# EasyEDA Pro project ProPrj_ROV_MINI_CTRL_2026-11-13.epro, schematic ROV_MINI_CTRL_V2.0.0

## Sheets
1 MCU: Assembly Variant: Basic; Board Name: Board2; Create Date: 2026-10-19; Page Name: MCU; Project Name: ROV_MINI_CTRL; Schematic Name: ROV_MINI_CTRL_V2.0.0; Update Date: 2026-10-19; Company: 嘉立创EDA; Page Size: A3; Version: V1.0
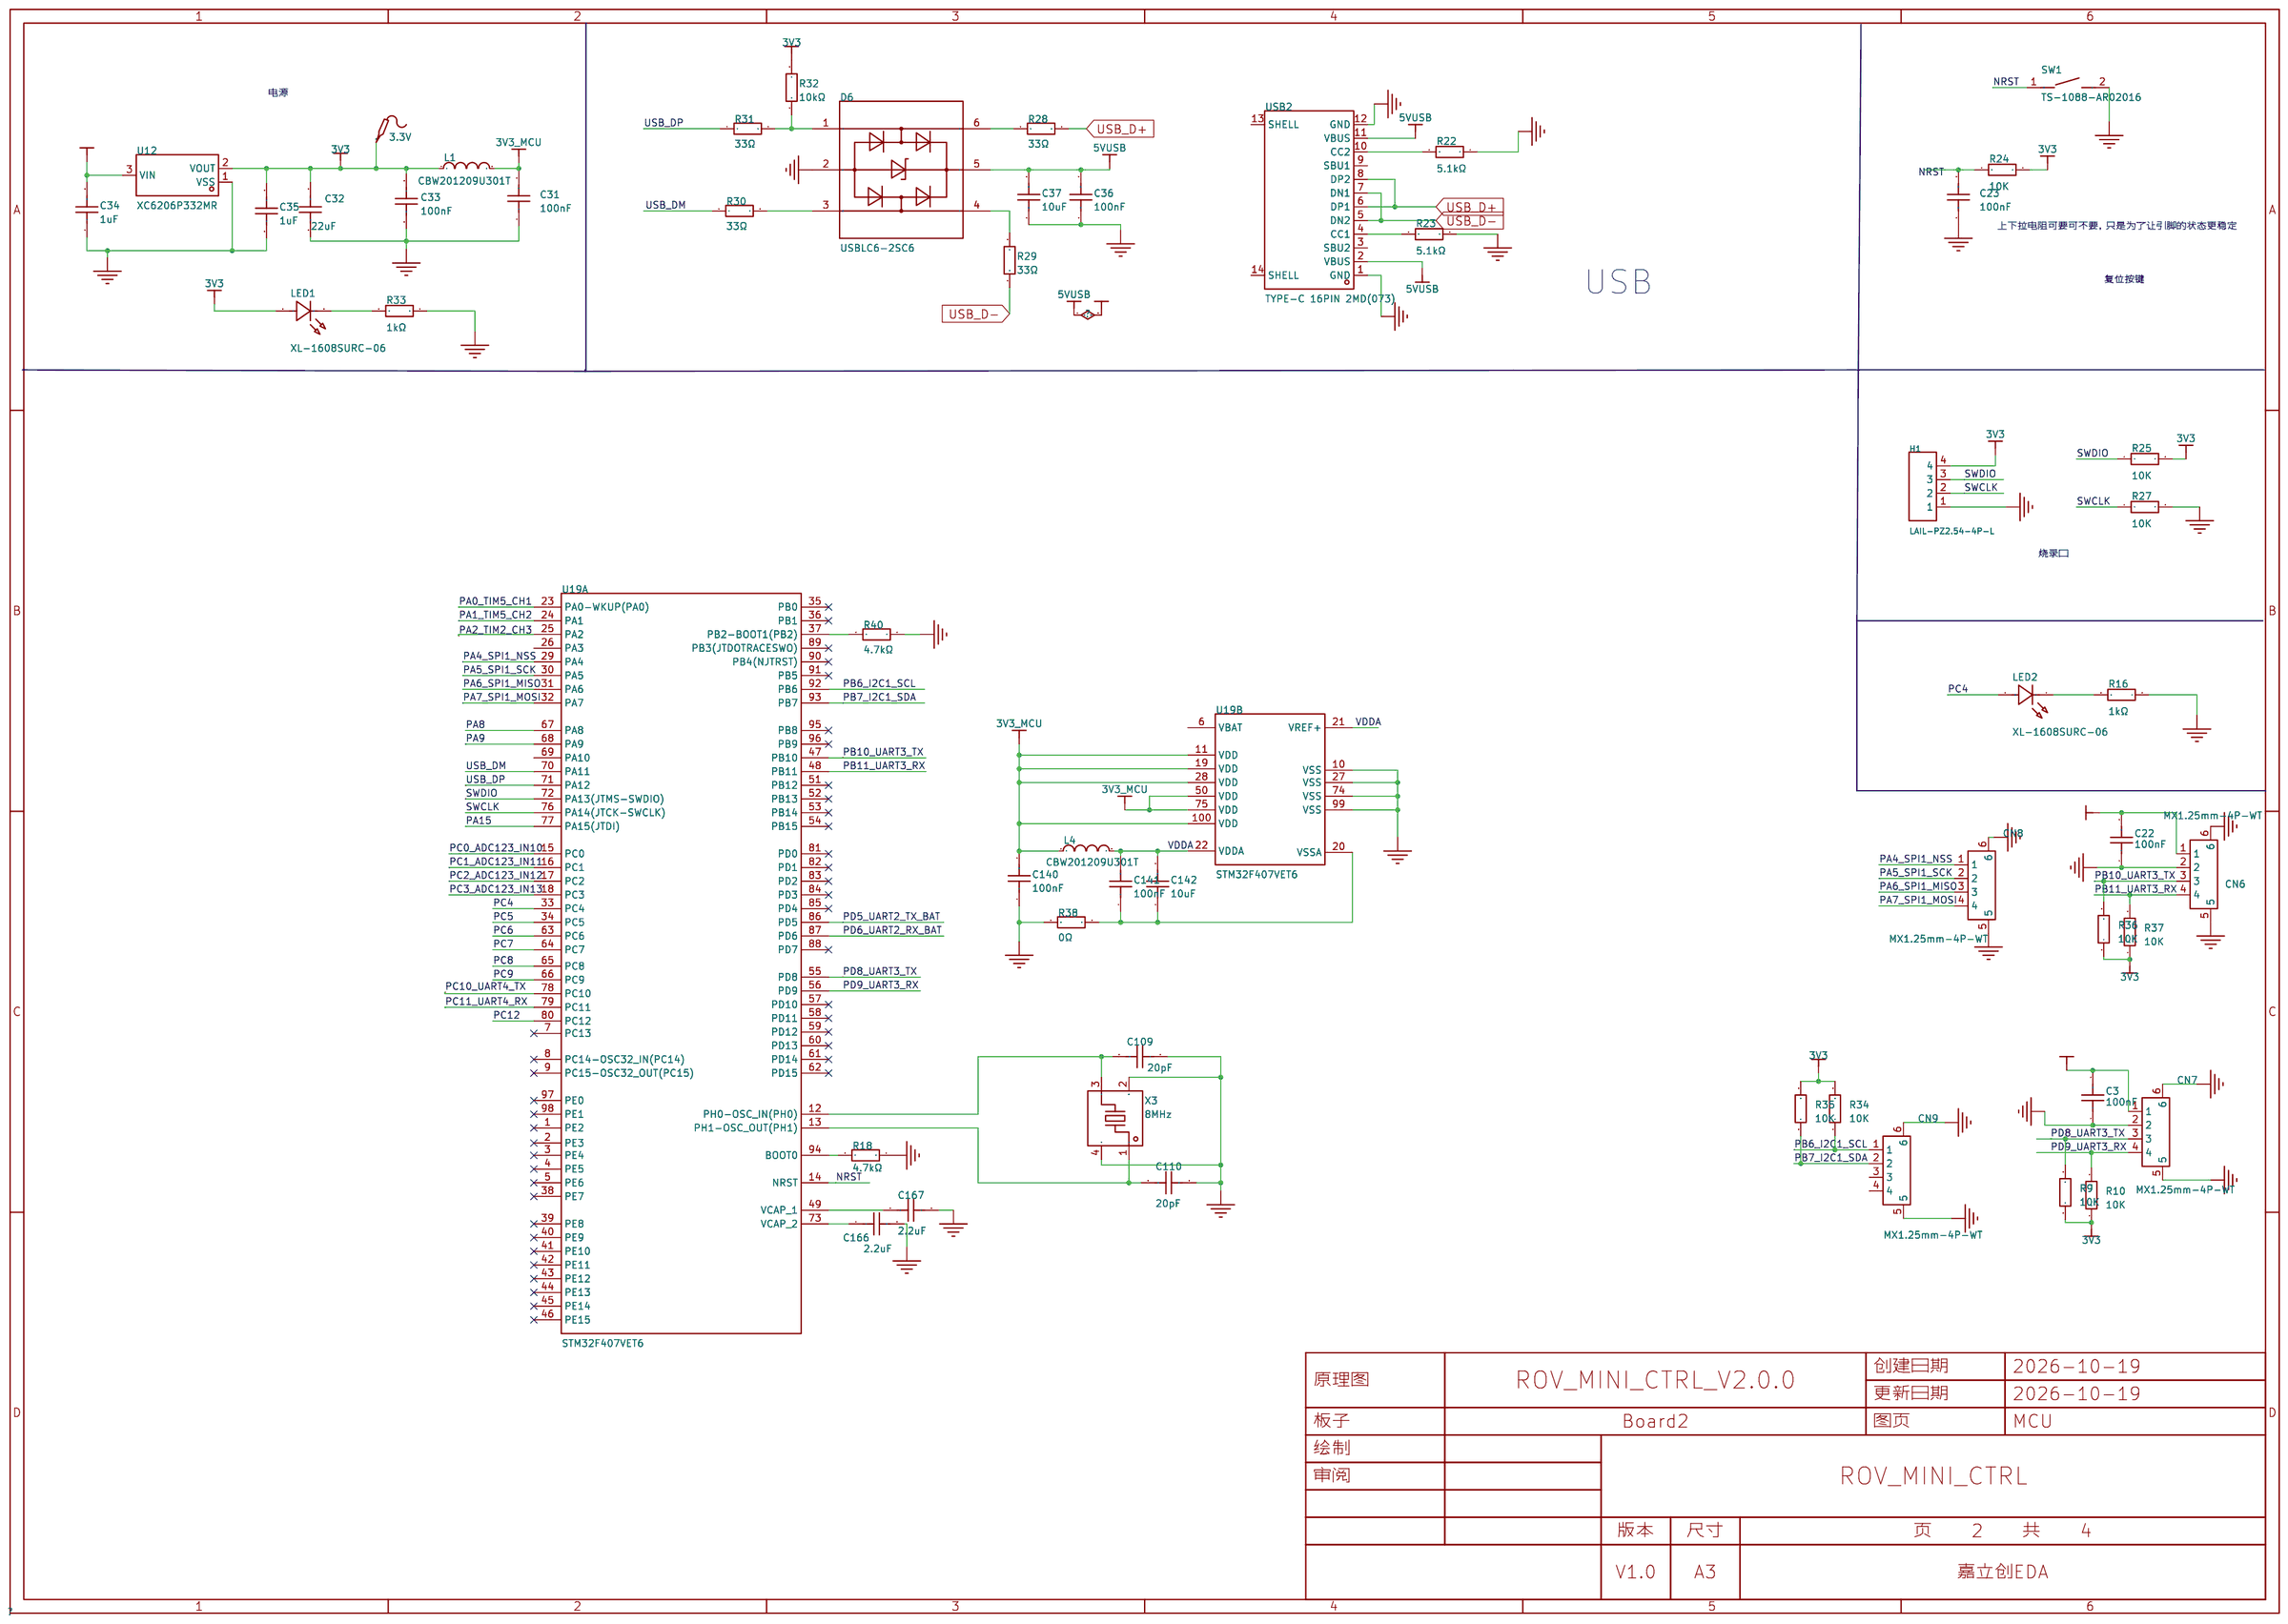
[diagram p3: MCU]
2 COM: Page Name: COM
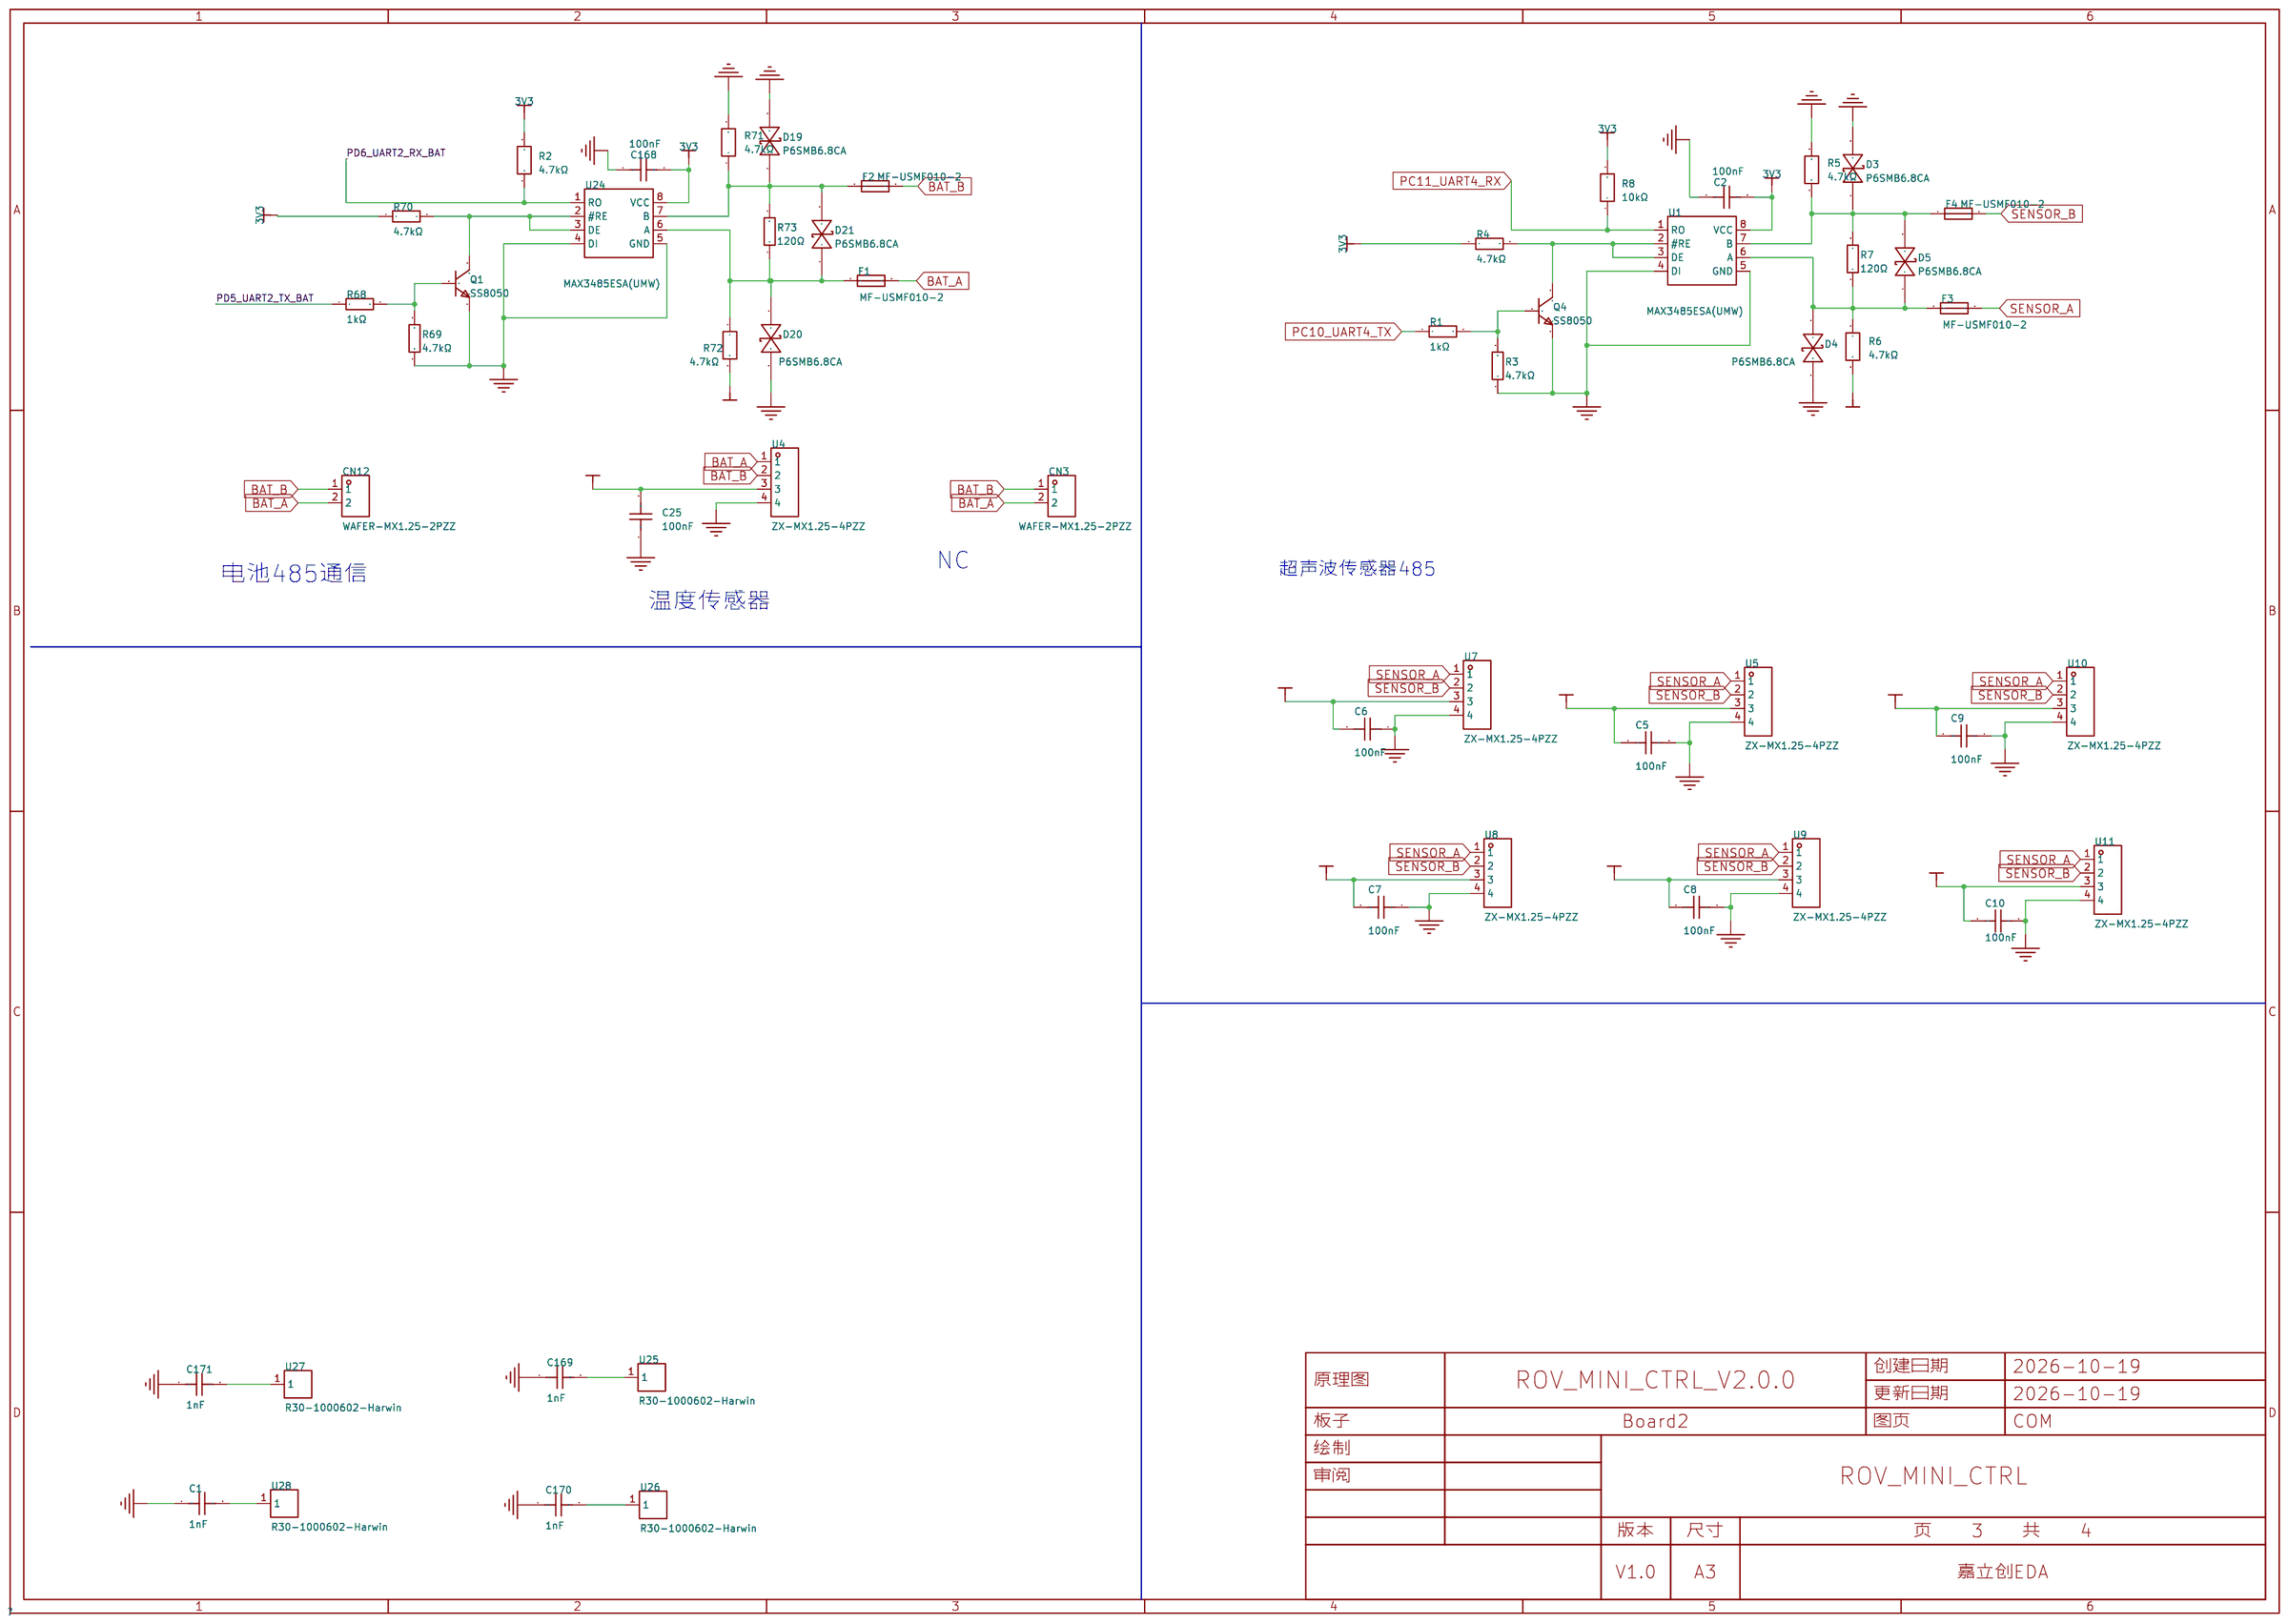
[diagram p4: COM]
3 POWER: Page Name: POWER
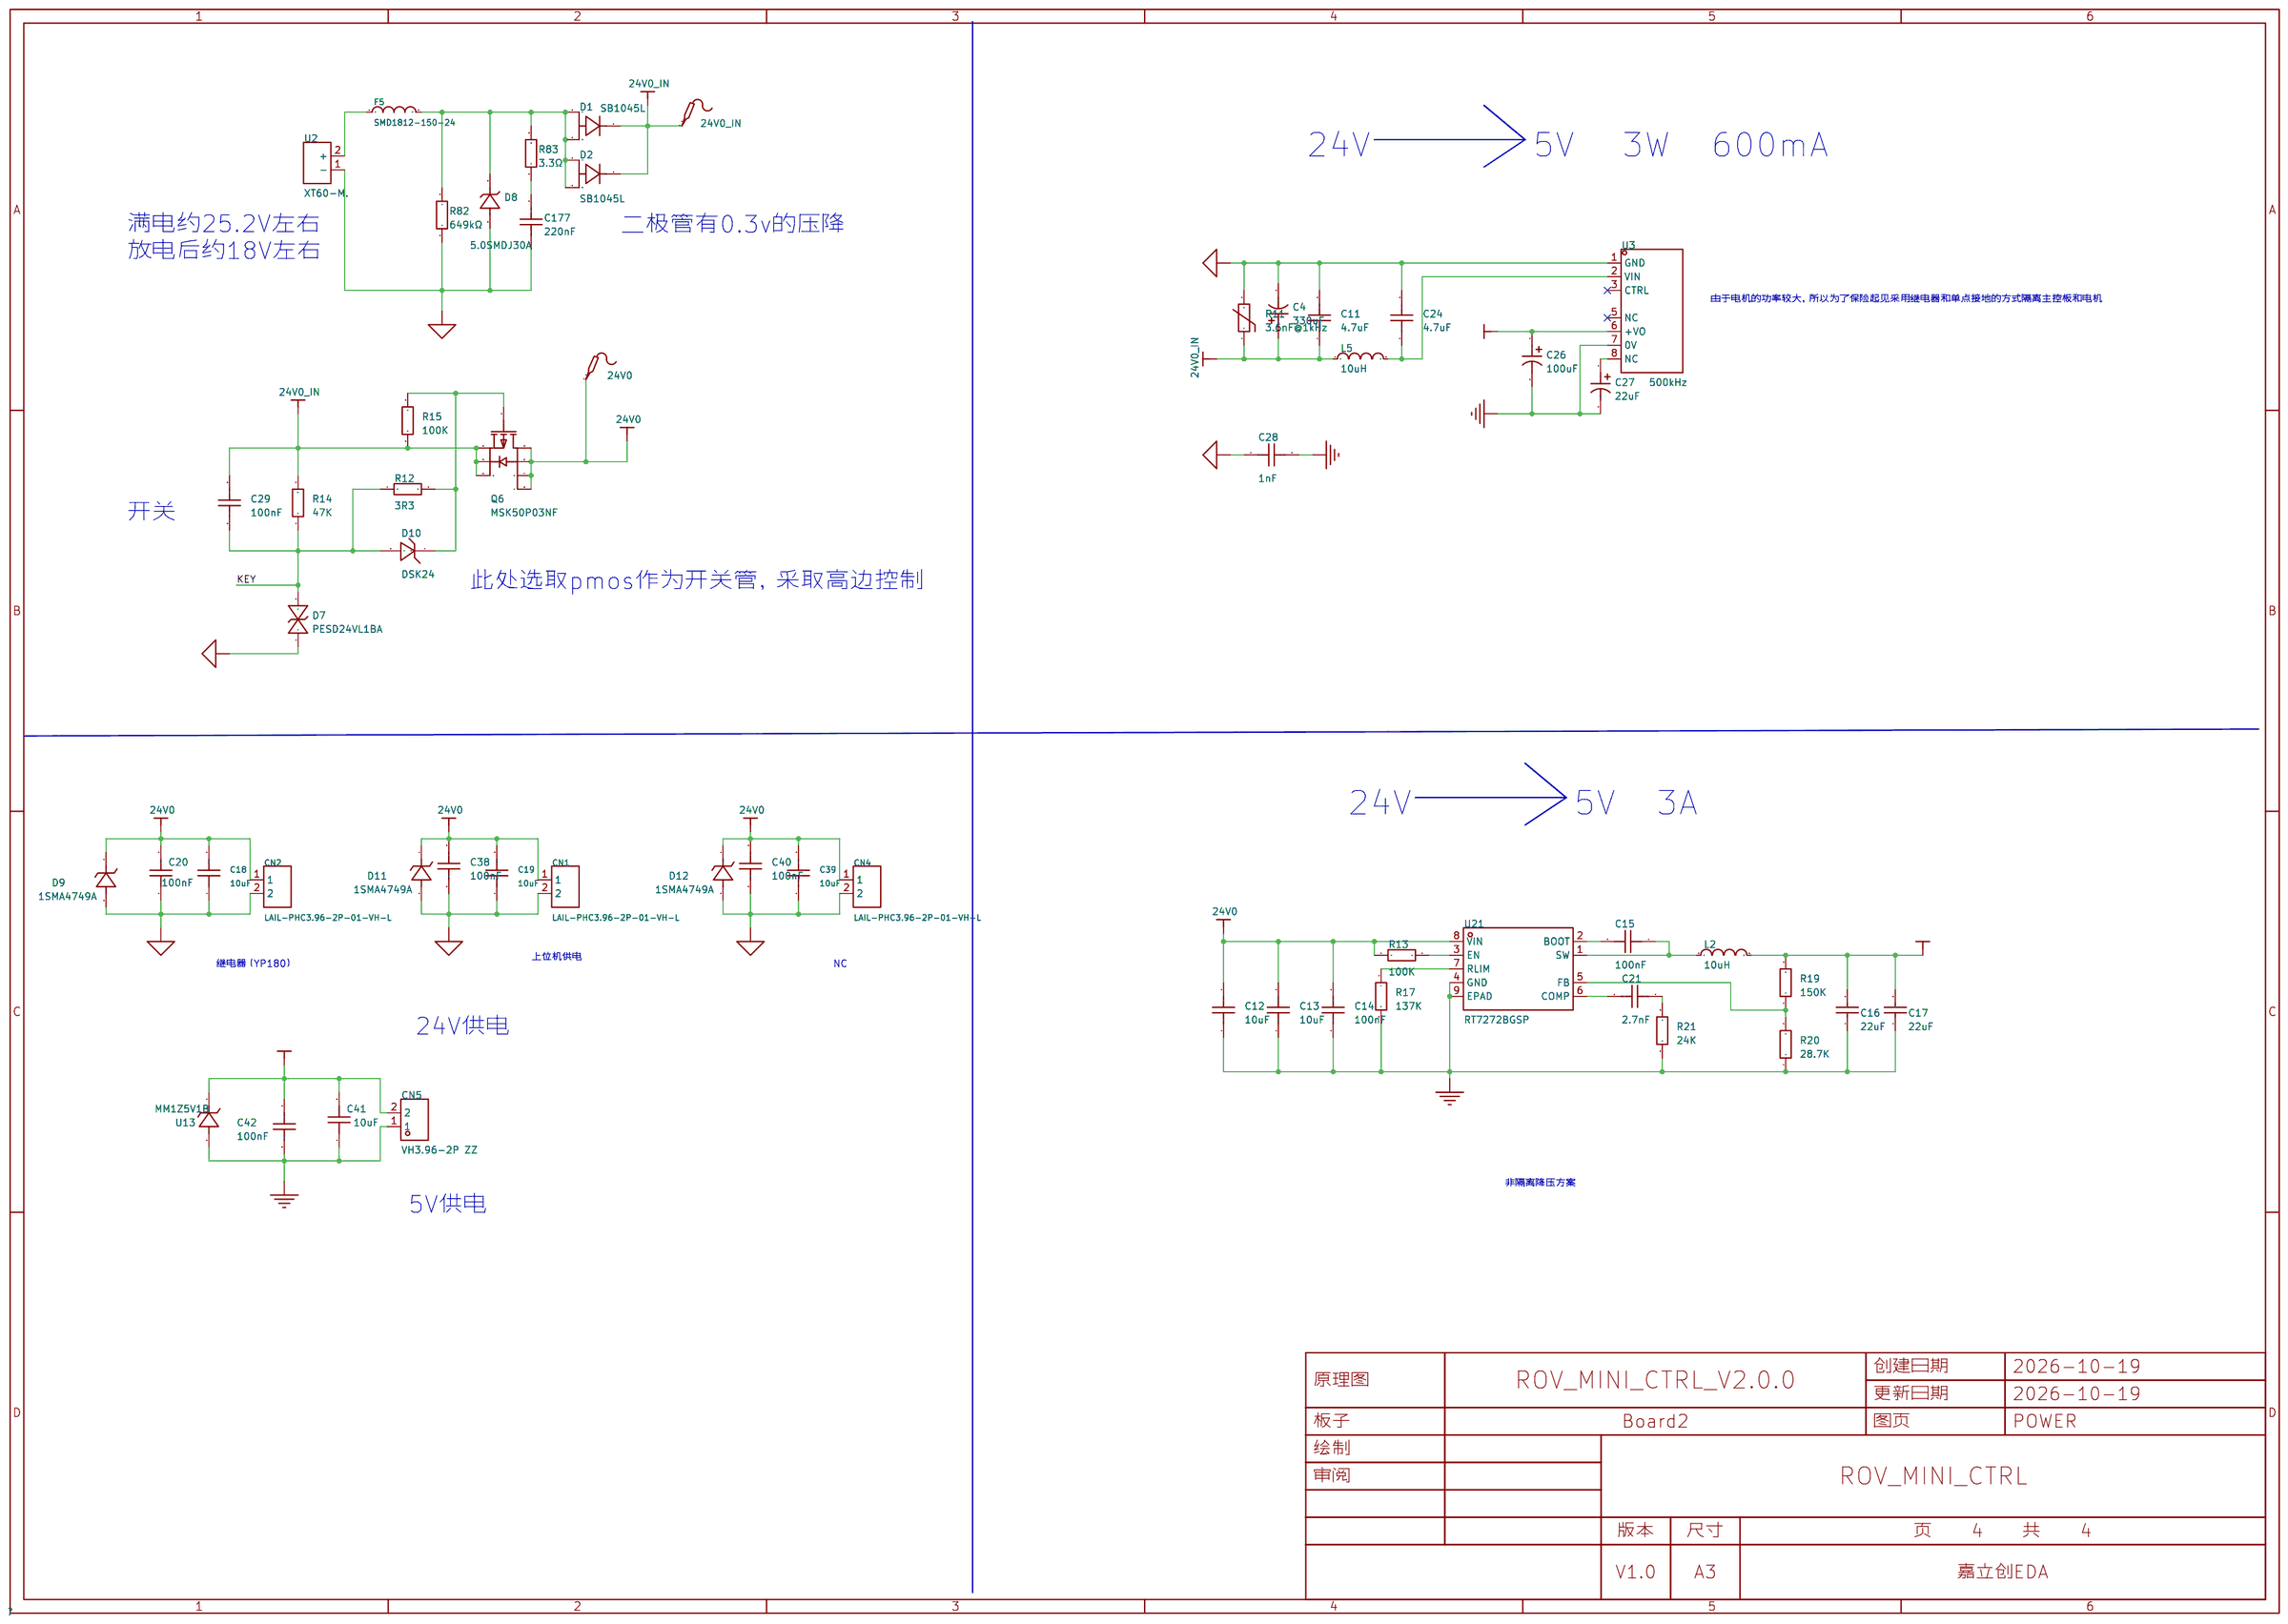
[diagram p5: POWER]
4 abstract: Create Date: 2026-10-16; Page Name: abstract; Update Date: 2026-10-16
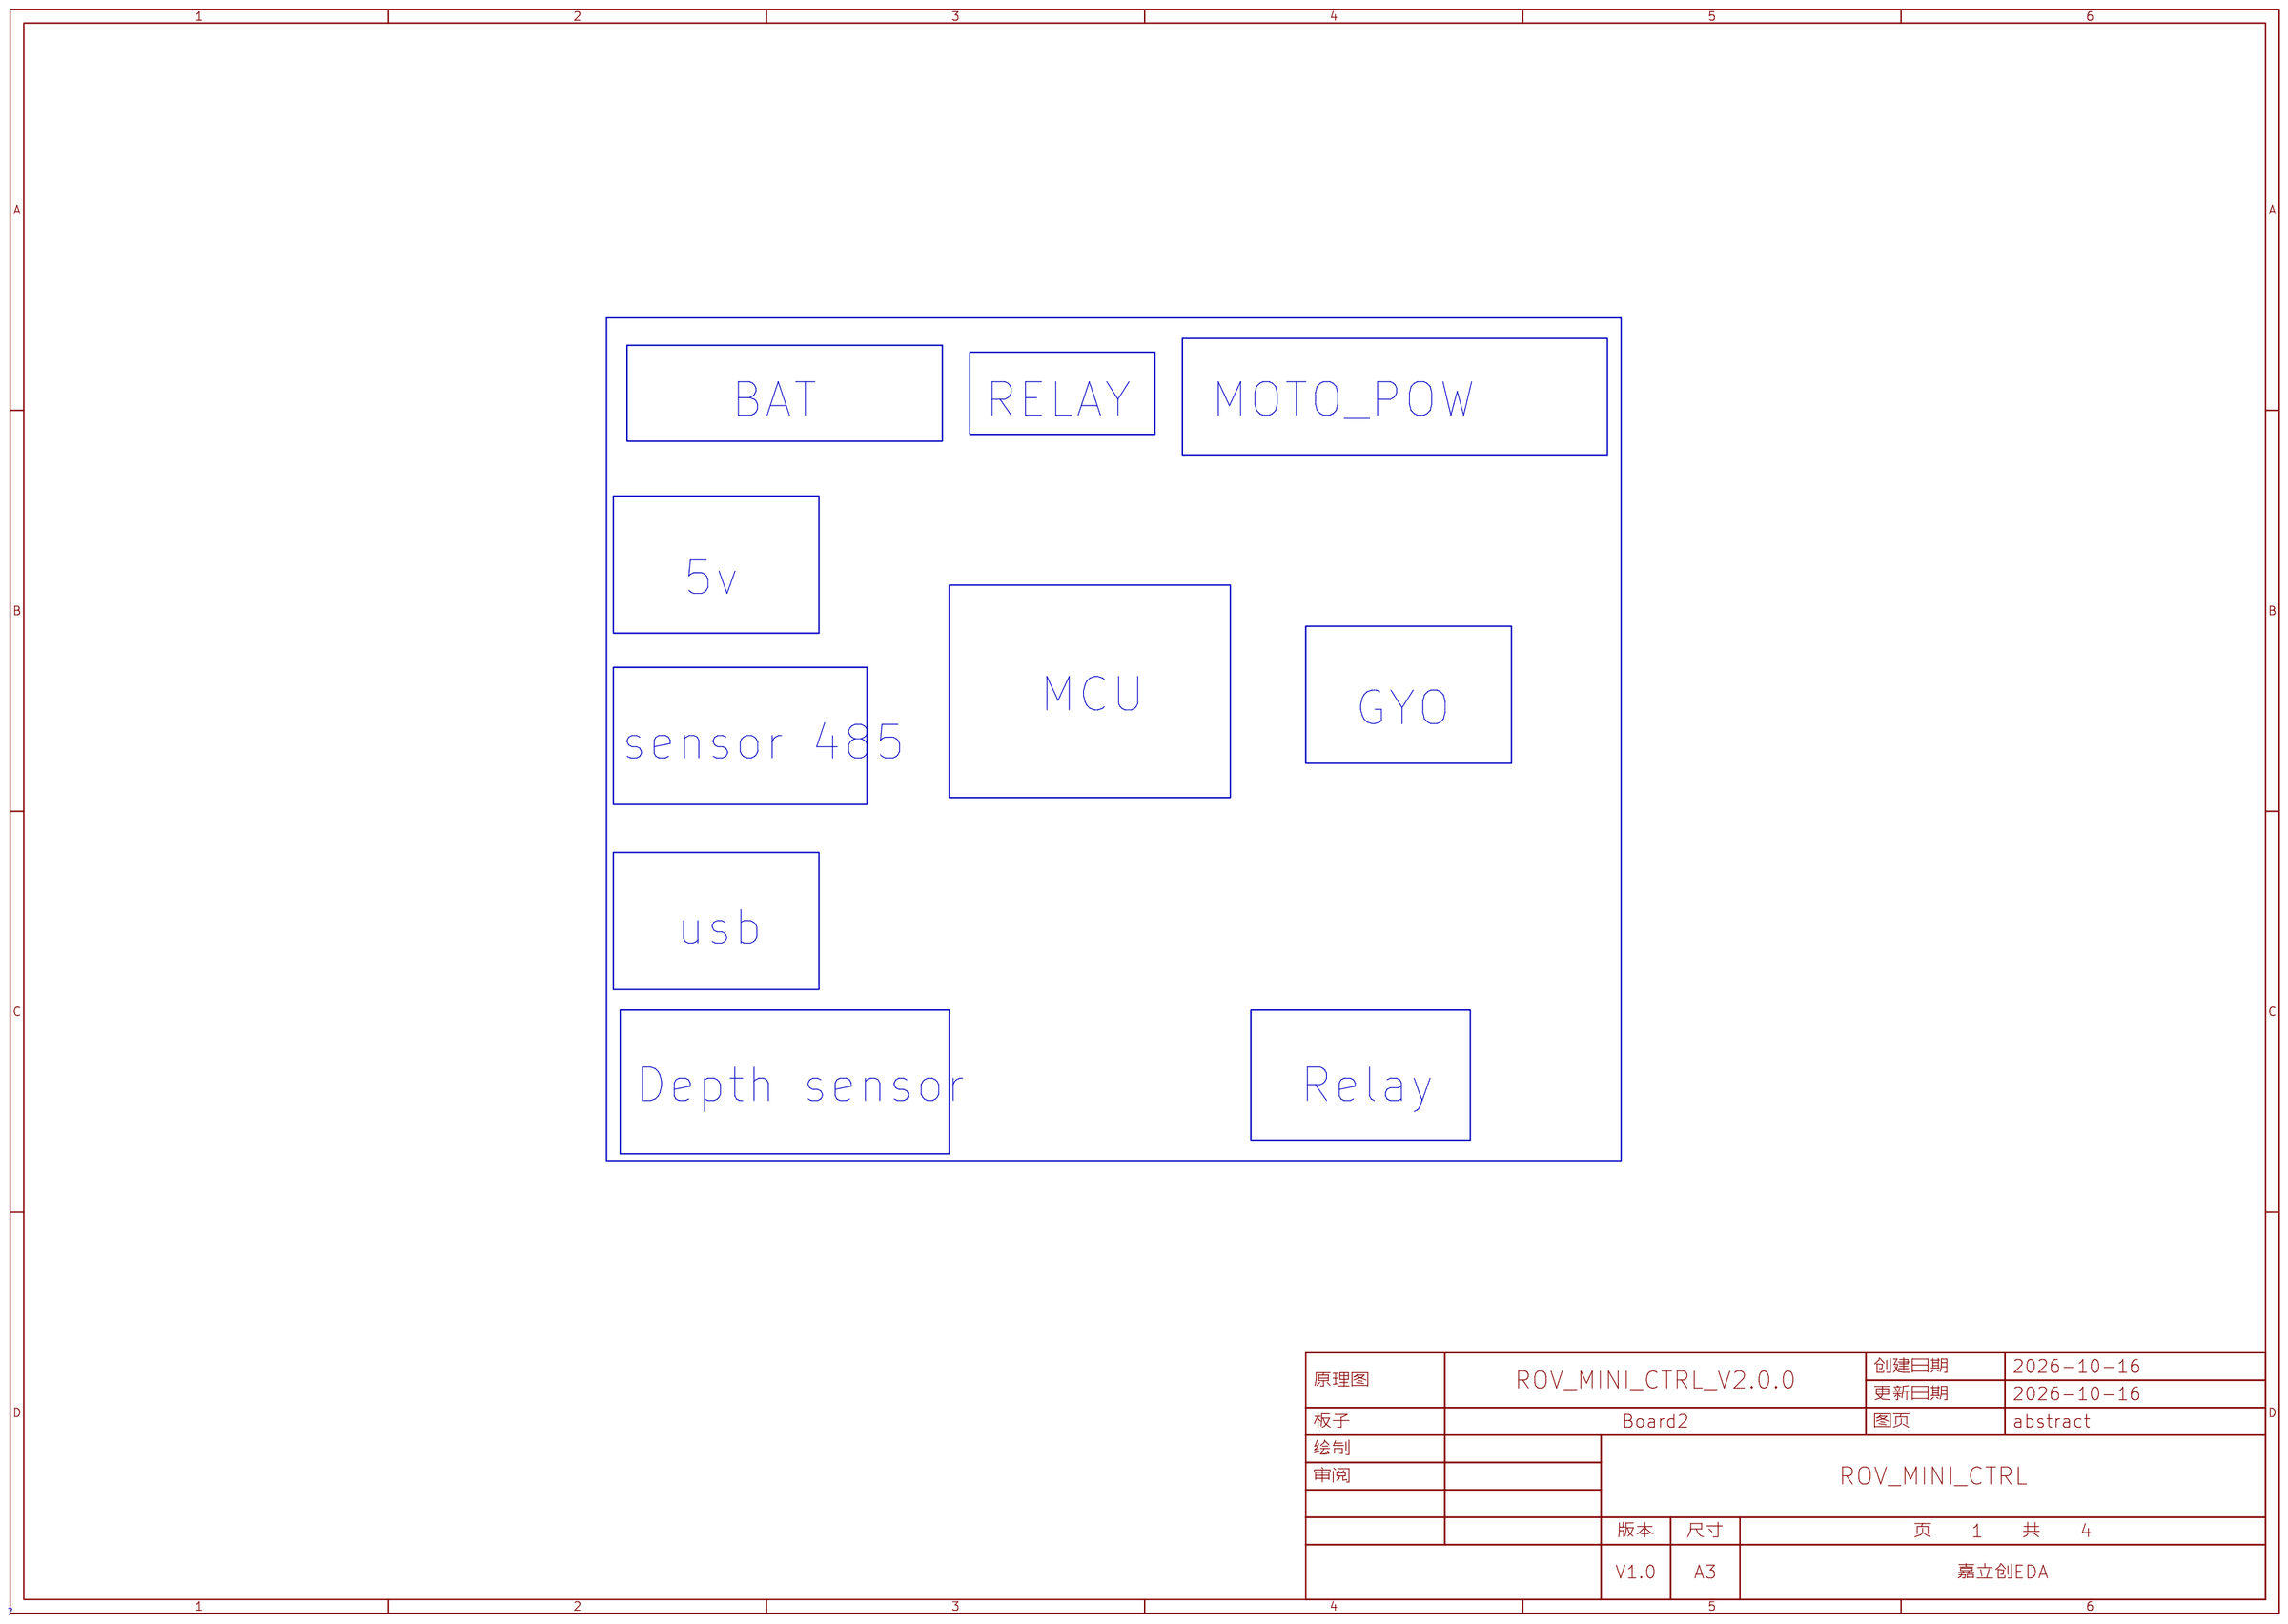
[diagram p6: abstract]

## Parts
sheet COM
C1  1nF  [C1206]
C2  100nF  [C0603]
C5  100nF  [C0603]
C6  100nF  [C0603]
C7  100nF  [C0603]
C8  100nF  [C0603]
C9  100nF  [C0603]
C10  100nF  [C0603]
C25  100nF  [C0603]
C168  100nF  [C0603]
C169  1nF  [C1206]
C170  1nF  [C1206]
C171  1nF  [C1206]
CN3  WAFER-MX1.25-2PZZ  [CONN-TH_2P-P1.25-V-M_721]
CN12  WAFER-MX1.25-2PZZ  [CONN-TH_2P-P1.25-V-M_721]
D3  P6SMB6.8CA  [SMB_L4.3-W3.6-LS5.4-BI]
D4  P6SMB6.8CA  [SMB_L4.3-W3.6-LS5.4-BI]
D5  P6SMB6.8CA  [SMB_L4.3-W3.6-LS5.4-BI]
D19  P6SMB6.8CA  [SMB_L4.3-W3.6-LS5.4-BI]
D20  P6SMB6.8CA  [SMB_L4.3-W3.6-LS5.4-BI]
D21  P6SMB6.8CA  [SMB_L4.3-W3.6-LS5.4-BI]
F1  MF-USMF010-2  [F1210]
F2  MF-USMF010-2  [F1210]
F3  MF-USMF010-2  [F1210]
F4  MF-USMF010-2  [F1210]
Q1  SS8050  [SOT-23_L2.9-W1.3-P1.90-LS2.4-BR]
Q4  SS8050  [SOT-23_L2.9-W1.3-P1.90-LS2.4-BR]
R1  1kΩ  [R0603]
R2  4.7kΩ  [R0603]
R3  4.7kΩ  [R0603]
R4  4.7kΩ  [R0603]
R5  4.7kΩ  [R0603]
R6  4.7kΩ  [R0603]
R7  120Ω  [R0603]
R8  10kΩ  [R0603]
R68  1kΩ  [R0603]
R69  4.7kΩ  [R0603]
R70  4.7kΩ  [R0603]
R71  4.7kΩ  [R0603]
R72  4.7kΩ  [R0603]
R73  120Ω  [R0603]
U1  MAX3485ESA(UMW)  [SOP-8_L5.0-W4.0-P1.27-LS6.0-BL]
U4  ZX-MX1.25-4PZZ  [CONN-TH_4P-P1.25_MEGASTAR_ZX-MX1.25-4PZZ]
U5  ZX-MX1.25-4PZZ  [CONN-TH_4P-P1.25_MEGASTAR_ZX-MX1.25-4PZZ]
U7  ZX-MX1.25-4PZZ  [CONN-TH_4P-P1.25_MEGASTAR_ZX-MX1.25-4PZZ]
U8  ZX-MX1.25-4PZZ  [CONN-TH_4P-P1.25_MEGASTAR_ZX-MX1.25-4PZZ]
U9  ZX-MX1.25-4PZZ  [CONN-TH_4P-P1.25_MEGASTAR_ZX-MX1.25-4PZZ]
U10  ZX-MX1.25-4PZZ  [CONN-TH_4P-P1.25_MEGASTAR_ZX-MX1.25-4PZZ]
U11  ZX-MX1.25-4PZZ  [CONN-TH_4P-P1.25_MEGASTAR_ZX-MX1.25-4PZZ]
U24  MAX3485ESA(UMW)  [SOP-8_L5.0-W4.0-P1.27-LS6.0-BL]
U25  R30-1000602-Harwin  [SMD_BD5.0-D3.0]
U26  R30-1000602-Harwin  [SMD_BD5.0-D3.0]
U27  R30-1000602-Harwin  [SMD_BD5.0-D3.0]
U28  R30-1000602-Harwin  [SMD_BD5.0-D3.0]
sheet MCU
3.3V  -  [Test-Point-0.5mm]
C3  100nF  [C0603]
C22  100nF  [C0603]
C23  100nF  [C0603]
C31  100nF  [C0603]
C32  22uF  [C0603]
C33  100nF  [C0603]
C34  1uF  [C0603]
C35  1uF  [C0603]
C36  100nF  [C0603]
C37  10uF  [C0603]
C109  20pF  [C0603]
C110  20pF  [C0603]
C140  100nF  [C0603]
C141  100nF  [C0603]
C142  10uF  [C0603]
C166  2.2uF  [C0603]
C167  2.2uF  [C0603]
CN6  MX1.25mm-4P-WT  [CONN-SMD_MX1.25MM-4P-WT]
CN7  MX1.25mm-4P-WT  [CONN-SMD_MX1.25MM-4P-WT]
CN8  MX1.25mm-4P-WT  [CONN-SMD_MX1.25MM-4P-WT]
CN9  MX1.25mm-4P-WT  [CONN-SMD_MX1.25MM-4P-WT]
D6  USBLC6-2SC6  [SOT-23-6_L2.9-W1.6-P0.95-LS2.8-BL]
H1  LAIL-PZ2.54-4P-L  [CONN-TH_LAIL-PZ2.54-4P-L]
L1  CBW201209U301T  [L0805]
L4  CBW201209U301T  [L0805]
LED1  XL-1608SURC-06  [LED0603-RD_RED]
LED2  XL-1608SURC-06  [LED0603-RD_RED]
R9  10K  [R0603]
R10  10K  [R0603]
R16  1kΩ  [R0603]
R18  4.7kΩ  [R0603]
R22  5.1kΩ  [R0603]
R23  5.1kΩ  [R0603]
R24  10K  [R0603]
R25  10K  [R0603]
R27  10K  [R0603]
R28  33Ω  [R0603]
R29  33Ω  [R0603]
R30  33Ω  [R0603]
R31  33Ω  [R0603]
R32  10kΩ  [R0603]
R33  1kΩ  [R0603]
R34  10K  [R0603]
R35  10K  [R0603]
R36  10K  [R0603]
R37  10K  [R0603]
R38  0Ω  [R0603]
R40  4.7kΩ  [R0603]
SW1  TS-1088-AR02016  [SW-SMD_L3.9-W3.0-P4.45]
U12  XC6206P332MR  [SOT-23-3_L3.0-W1.7-P0.95-LS2.9-BR]
U19  STM32F407VET6  [LQFP-100_L14.0-W14.0-P0.50-LS16.0-BL]  (sections 1,2)
USB2  TYPE-C 16PIN 2MD(073)  [USB-C-SMD_TYPE-C-6PIN-2MD-073]
X3  8MHz  [CRYSTAL-SMD_4P-L3.2-W2.5-BL]
sheet POWER
24V0  -  [Test-Point-0.5mm]
24V0_IN  -  [Test-Point-0.5mm]
C4  330uF  [CAP-SMD_BD10.0-L10.3-W10.3-FD-LS11.0]
C11  4.7uF  [C0805]
C12  10uF  [C0603]
C13  10uF  [C0603]
C14  100nF  [C0603]
C15  100nF  [C0603]
C16  22uF  [C1206]
C17  22uF  [C1206]
C18  10uF  [C1206]
C19  10uF  [C1206]
C20  100nF  [C0603]
C21  2.7nF  [C0603]
C24  4.7uF  [C0805]
C26  100uF  [CAP-SMD_BD6.3-L6.6-W6.6-LS7.3-FD-H7.7]
C27  22uF  [CAP-SMD_BD6.3-L6.6-W6.6-LS7.2-FD_3]
C28  1nF  [CAP-TH_L7.5-W4.5-P10.00-D0.6]
C29  100nF  [C0603]
C38  100nF  [C0603]
C39  10uF  [C1206]
C40  100nF  [C0603]
C41  10uF  [C0603]
C42  100nF  [C0603]
C177  220nF  [C0603]
CN1  LAIL-PHC3.96-2P-01-VH-L  [CONN-TH_2P-P3.96_YTC-A3961-2A]
CN2  LAIL-PHC3.96-2P-01-VH-L  [CONN-TH_2P-P3.96_YTC-A3961-2A]
CN4  LAIL-PHC3.96-2P-01-VH-L  [CONN-TH_2P-P3.96_YTC-A3961-2A]
CN5  VH3.96-2P ZZ  [CONN-TH_2P-P3.96_C9900035759]
D1  SB1045L  [TO-277_3P-L5.4-W4.0-LS6.5-TR]
D2  SB1045L  [TO-277_3P-L5.4-W4.0-LS6.5-TR]
D7  PESD24VL1BA  [SOD-323_L1.7-W1.3-LS2.5-BI-1]
D8  5.0SMDJ30A  [SMC_L6.9-W5.9-LS7.9-RD]
D9  1SMA4749A  [SMA_L4.3-W2.6-LS5.0-RD]
D10  DSK24  [SOD-123FL_L2.7-W1.8-LS3.8-RD]
D11  1SMA4749A  [SMA_L4.3-W2.6-LS5.0-RD]
D12  1SMA4749A  [SMA_L4.3-W2.6-LS5.0-RD]
F5  SMD1812-150-24  [F1812]
L2  10uH  [IND-SMD_L7.1-W6.6]
L5  10uH  [IND-TH_L16.0-W8.5-P5.00-D0.7]
Q6  MSK50P03NF  [DFN-8_L6.0-W5.0-P1.27-LS6.2-BL]
R11  3.6nF@1kHz  [RES-TH_L16.0-W4.5-P7.50-D0.8]
R12  3R3  [R0603]
R13  100K  [R0603]
R14  47K  [R0603]
R15  100K  [R0603]
R17  137K  [R0603]
R19  150K  [R0603]
R20  28.7K  [R0603]
R21  24K  [R0603]
R82  649kΩ  [R0603]
R83  3.3Ω  [R0603]
U2  XT60-M.  [CONN-TH_XT60]
U3  500kHz  [PWRM-TH_URBXXXXS-6WR3]
U13  MM1Z5V1B  [SOD-123_L2.7-W1.6-LS3.7-RD]
U21  RT7272BGSP  [SOIC-8_L5.0-W4.0-P1.27-LS6.0-BL-EP2.0]

## Library data of the parts
C1 C169-C171 = 1206B102K202NT: 容值:1nF;精度:±10%;额定电压:2kV;温度系数:X7R;; LCSC Part Name: 1nF ±10% 2kV; Supplier Part: C9196; Manufacturer: FH(风华); Supplier Footprint: 1206; JLCPCB Part Class: Basic Part; Datasheet: https://atta.szlcsc.com/upload/public/pdf/source/20200305/C486355_26A10D38EF8C2A5C37091D0039909270.pdf; Supplier: LCSC; Tolerance: ±10%; Voltage Rating: 2kV; Temperature Coefficient: X7R
C2 C31 C33 C36 C140 C141 C168 = CGA0603X7R104K500JT: 容值:100nF;精度:±10%;额定电压:50V;温度系数:X7R;; LCSC Part Name: 100nF ±10% 50V; Supplier Part: C6119867; Manufacturer: HRE(芯声); Supplier Footprint: 0603; JLCPCB Part Class: Extended Part; Datasheet: https://atta.szlcsc.com/upload/public/pdf/source/20250103/C44077DA9E7B3EFAE02F22B6D3D1CBC9.pdf; Supplier: LCSC; Tolerance: ±10%; Voltage Rating: 50V; Temperature Coefficient: X7R
C3 C5-C10 C12-C15 C20-C23 C25 C29 C38 C40 = CAP_0603: Supplier Footprint: 0603
CN3 CN12 = WAFER-MX1.25-2PZZ: 插针结构:1x2P;间距:1.25mm;安装方式:直插;参考系列:PicoBlade(MX 1.25);总PIN数:2P;排数:1;每排PIN数:2;行距:-;额定电流:1A;触头材质:黄铜;触头镀层:锡;工作温度:-25℃~+85℃;; LCSC Part Name: 1x2P 间距:1.25mm 直插 系列:PicoBlade(MX 1.25); Supplier Part: C3029395; Manufacturer: XUNPU(讯普); Supplier Footprint: 插件,P=1.25mm; JLCPCB Part Class: 扩展库; Datasheet: https://item.szlcsc.com/datasheet/WAFER-MX1.25-2PZZ/3561407.html; Supplier: LCSC; Pins Structure: 1x2P; Pitch: 1.25mm; Mounting Type: 直插; Reference Series: PicoBlade(MX 1.25); Number of Pins: 2P; Number of Rows: 1; Number of PINs Per Row: 2; Current Rating: 1A; Contact Material: 黄铜; Contact Plating: 锡; Operating Temperature: -25℃~+85℃; Voltage Rating: 125V; Plastic Material: LCP; Flame Retardant Rating: UL94V-0; Color: 米色; Z-Height of the Board: 4.6mm; X-Length of Bottom Edge on Board (Spacing Line): 4.4mm; Y-Width of Bottom Edge on Board: 3.3mm
D3-D5 D19-D21 = P6SMB6.8CA_C2758563: 反向截止电压(Vrwm):5.8V;钳位电压:10.5V;峰值脉冲电流(Ipp):57.1A;击穿电压:6.45V;; Supplier Part: C2758563; Manufacturer: UMW(友台半导体); Supplier Footprint: SMB; JLCPCB Part Class: 扩展库; Datasheet: https://atta.szlcsc.com/upload/public/pdf/source/20220418/9BDF7C7F05B151FF0DC9933F98EB12D8.pdf; Supplier: LCSC; Reverse Stand-Off Voltage (Vrwm): 5.8V; Clamping Voltage: 10.5V; Peak Pulse Current (Ipp): 57.1A; Voltage - Breakdown: 6.45V; Reverse Leakage Current (Ir): 1mA; Type: TVS
F1-F4 = MF-USMF010-2: 耐压(Vmax):30V;最大电流(Imax):-;保持电流(Ihold):-;跳闸电流(Itrip):-;; LCSC Part Name: 30V 100mA 1210自恢复; Supplier Part: C210359; Manufacturer: BOURNS; Supplier Footprint: 1210; JLCPCB Part Class: 扩展库; Datasheet: https://item.szlcsc.com/datasheet/MF-USMF010-2/211706.html; Supplier: LCSC; Voltage - Max: 30V; Resistance - Initial (Ri) (Min): 800mΩ; Resistance - Post Trip (R1) (Max): 15Ω; Operating Temperature: -40℃~+85℃; Length: 3.2mm; Width: 2.5mm
Q1 Q4 = SS8050_C431710: 晶体管类型:NPN;集电极电流(Ic):1.5A;集射极击穿电压(Vceo):25V;功率(Pd):300mW;直流电流增益(hFE@Ic,Vce):120@100mA,1V;; LCSC Part Name: NPN 电流:1.5A 耐压:25V (200-350); Supplier Part: C431710; Manufacturer: MDD(辰达半导体); Supplier Footprint: SOT-23; JLCPCB Part Class: 扩展库; Datasheet: https://atta.szlcsc.com/upload/public/pdf/source/20240710/2275D45831FEB988B7478BE0F5F4041C.pdf; Supplier: LCSC; Transistor Type: NPN; Collector Current (Ic): 1.5A; Collector-Emitter Breakdown Voltage (Vceo): 25V; Power Dissipation (Pd): 300mW; DC Current Gain (hFE@Ic,Vce): 120@100mA,1V; Transition Frequency (fT): 100MHz; Collector Cut-Off Current (Icbo): 100nA; Collector-Emitter Saturation Voltage (VCE(sat)@Ic,Ib): 500mV@800mA,80mA; Operating Temperature: -55℃~+150℃
R1 R16 R33 R68 = 0603WAF1001T5E: 电阻类型:厚膜电阻;阻值:1kΩ;精度:±1%;功率:100mW;工作电压:75V;温度系数:±100ppm/℃;; LCSC Part Name: 1kΩ ±1% 100mW 厚膜电阻; Supplier Part: C21190; Manufacturer: UNI-ROYAL(厚声); Supplier Footprint: 0603; JLCPCB Part Class: Basic Part; Datasheet: https://item.szlcsc.com/datasheet/0603WAF1001T5E/21904.html; Supplier: LCSC; Type: 厚膜电阻; Tolerance: ±1%; Power(Watts): 100mW; Overload Voltage (Max): 75V; Temperature Coefficient: ±100ppm/℃; Operating Temperature Range: -55℃~+155℃; Voltage-Supply(Max): 75V; Operating Temperature: -55℃~+155℃
R2 R5 R6 R18 R40 R71 R72 = FRC0603J472 TS: 电阻类型:厚膜电阻;阻值:4.7kΩ;精度:±5%;功率:100mW;工作电压:75V;温度系数:±100ppm/℃;; LCSC Part Name: 4.7kΩ ±5% 100mW 厚膜电阻; Supplier Part: C2907166; Manufacturer: FOJAN(富捷); Supplier Footprint: 0603; JLCPCB Part Class: Extended Part; Supplier: LCSC; Type: 厚膜电阻; Tolerance: ±5%; Power(Watts): 100mW; Voltage-Supply(Max): 75V; Temperature Coefficient: ±100ppm/℃; Operating Temperature: -55℃~+155℃
R3 R4 R69 R70 = 0603WAF4701T5E: 电阻类型:厚膜电阻;阻值:4.7kΩ;精度:±1%;功率:100mW;工作电压:75V;温度系数:±100ppm/℃;; LCSC Part Name: 4.7kΩ ±1% 100mW 厚膜电阻; Supplier Part: C23162; Manufacturer: UNI-ROYAL(厚声); Supplier Footprint: 0603; JLCPCB Part Class: Basic Part; Datasheet: https://item.szlcsc.com/datasheet/0603WAF4701T5E/23889.html; Supplier: LCSC; Type: 厚膜电阻; Tolerance: ±1%; Power(Watts): 100mW; Voltage-Supply(Max): 75V; Temperature Coefficient: ±100ppm/℃; Operating Temperature: -55℃~+155℃
R7 R73 = 0603WAF1200T5E: 电阻类型:厚膜电阻;阻值:120Ω;精度:±1%;功率:100mW;工作电压:75V;温度系数:±100ppm/℃;; LCSC Part Name: 120Ω ±1% 100mW 厚膜电阻; Supplier Part: C22787; Manufacturer: UNI-ROYAL(厚声); Supplier Footprint: 0603; JLCPCB Part Class: Basic Part; Datasheet: https://item.szlcsc.com/datasheet/0603WAF1200T5E/23514.html; Supplier: LCSC; Type: 厚膜电阻; Tolerance: ±1%; Power(Watts): 100mW; Voltage-Supply(Max): 75V; Temperature Coefficient: ±100ppm/℃; Operating Temperature: -55℃~+155℃
R8 = FRC0603J103 TS: 电阻类型:厚膜电阻;阻值:10kΩ;精度:±5%;功率:100mW;工作电压:75V;温度系数:±100ppm/℃;; LCSC Part Name: 10kΩ ±5% 100mW 厚膜电阻; Supplier Part: C2930027; Manufacturer: FOJAN(富捷); Supplier Footprint: 0603; JLCPCB Part Class: Extended Part; Datasheet: https://item.szlcsc.com/datasheet/FRC0603J103%2520TS/3266960.html; Supplier: LCSC; Type: 厚膜电阻; Tolerance: ±5%; Power(Watts): 100mW; Voltage-Supply(Max): 75V; Temperature Coefficient: ±100ppm/℃; Operating Temperature: -55℃~+155℃
U1 U24 = MAX3485ESA(UMW): 类型:收发器;数据速率:12Mbps;; LCSC Part Name: MAX3485E 3.3V供电，半双工，12Mbps速率，RS485/RS422收发器; Supplier Part: C668204; Manufacturer: UMW(友台半导体); Supplier Footprint: SOP-8; JLCPCB Part Class: 扩展库; Datasheet: https://item.szlcsc.com/datasheet/MAX3485ESA(UMW)/698052.html; Supplier: LCSC; Type: 收发器; Number of Drivers: 1; Number of Receivers: 1; Voltage - Supply: 2.97V~3.63V; Data Rate: 12Mbps; Number of Nodes: 256; Operating Temperature: -40℃~+85℃; Communication Mode: 半双工
U4 U5 U7-U11 = ZX-MX1.25-4PZZ: 插针结构:1x4P;间距:1.25mm;安装方式:直插;参考系列:PicoBlade(MX 1.25);总PIN数:4P;排数:1;每排PIN数:4;行距:-;额定电流:1A;触头材质:黄铜;触头镀层:锡;工作温度:-25℃~+85℃;; LCSC Part Name: 1x4P 间距:1.25mm 直插 系列:PicoBlade(MX 1.25); Supplier Part: C7430460; Manufacturer: Megastar(兆星); Supplier Footprint: 插件,P=1.25mm; JLCPCB Part Class: Extended Part; Datasheet: https://item.szlcsc.com/datasheet/ZX-MX1.25-4PZZ/8430329.html; Supplier: LCSC; Pins Structure: 1x4P; Pitch: 1.25mm; Mounting Type: 直插; Reference Series: PicoBlade(MX 1.25); Number of Pins: 4P; Number of Rows: 1; Number of PINs Per Row: 4; Current Rating: 1A; Contact Material: 黄铜; Contact Plating: 锡; Operating Temperature: -25℃~+85℃; Voltage Rating: 125V; Plastic Material: LCP; Flame Retardant Rating: UL94V-0; Color: 米色; Z-Height of the Board: 4.6mm; X-Length of Bottom Edge on Board (Spacing Line): 6.9mm; Y-Width of Bottom Edge on Board: 3.3mm
U25-U28 = R30-1000602-Harwin: LCSC Part Name: HARWIN M3 x 0.5六角黄铜螺母柱,6mm总长,5mm六角对边, R30-1000602 rs1613559; Supplier Part: C47018769; Manufacturer: Harwin; Datasheet: https://item.szlcsc.com/datasheet/R30-1000602-Harwin/49200836.html; Supplier: LCSC
3.3V 24V0 = Test-Point: Test Point 测试点
C32 = CL10A226MQ8NRNC: 容值:22uF;精度:±20%;额定电压:6.3V;温度系数:X5R;; LCSC Part Name: 22uF ±20% 6.3V; Supplier Part: C59461; Manufacturer: SAMSUNG(三星); Supplier Footprint: 0603; JLCPCB Part Class: Basic Part; Datasheet: https://item.szlcsc.com/datasheet/CL10A226MQ8NRNC/60514.html; Supplier: LCSC; Tolerance: ±20%; Voltage Rating: 6.3V; Temperature Coefficient: X5R
C34 C35 = CGA0603X5R105K500JT: 容值:1uF;精度:±10%;额定电压:50V;温度系数:X5R;; LCSC Part Name: 1uF ±10% 50V; Supplier Part: C6119852; Manufacturer: HRE(芯声); Supplier Footprint: 0603; JLCPCB Part Class: Extended Part; Supplier: LCSC; Tolerance: ±10%; Voltage Rating: 50V; Temperature Coefficient: X5R
C37 C142 = CL10A106MA8NRNC: 容值:10uF;精度:±20%;额定电压:25V;温度系数:X5R;; LCSC Part Name: 10uF ±20% 25V; Supplier Part: C96446; Manufacturer: SAMSUNG(三星); Supplier Footprint: 0603; JLCPCB Part Class: Basic Part; Datasheet: https://item.szlcsc.com/datasheet/CL10A106MA8NRNC/97651.html; Supplier: LCSC; Tolerance: ±20%; Voltage Rating: 25V; Temperature Coefficient: X5R
C109 C110 = CC0603JRNPO9BN200: 容值:20pF;精度:±5%;额定电压:50V;材质(温度系数):NP0;; LCSC Part Name: 20pF ±5% 50V; Supplier Part: C105621; Manufacturer: YAGEO(国巨); Supplier Footprint: 0603; JLCPCB Part Class: Extended Part; Datasheet: https://atta.szlcsc.com/upload/public/pdf/source/20170505/1493957838062.pdf; Supplier: LCSC; Tolerance: ±5%; Voltage Rated: 50V; Temperature Coefficient: NP0
C166 C167 = CL10A225KO8NNNC: 容值:2.2uF;精度:±10%;额定电压:16V;温度系数:X5R;; LCSC Part Name: 2.2uF ±10% 16V; Supplier Part: C23630; Manufacturer: SAMSUNG(三星); Supplier Footprint: 0603; JLCPCB Part Class: Basic Part; Datasheet: https://item.szlcsc.com/datasheet/CL10A225KO8NNNC/24366.html; Supplier: LCSC; Tolerance: ±10%; Voltage Rating: 16V; Temperature Coefficient: X5R
CN6-CN9 = MX1.25mm-4P-WT: 插针结构:1x4P;间距:1.25mm;安装方式:卧贴;参考系列:PicoBlade(MX 1.25);总PIN数:4P;排数:1;每排PIN数:4;额定电流:1A;触头材质:黄铜;触头镀层:锡;工作温度:-25℃~+85℃;; LCSC Part Name: 1x4P 间距:1.25mm 卧贴 系列:PicoBlade(MX 1.25); Supplier Part: C53055350; Manufacturer: LXWCONN(连兴旺电子); Supplier Footprint: SMD,P=1.25mm,卧贴; JLCPCB Part Class: Extended Part; Datasheet: https://item.szlcsc.com/datasheet/MX1.25mm-4P-WT/55999550.html; Supplier: LCSC; Pins Structure: 1x4P; Pitch: 1.25mm; Mounting Type: 卧贴; Reference Series: PicoBlade(MX 1.25); Number of Pins: 4P; Number of Rows: 1; Number of PINs Per Row: 4; Current Rating: 1A; Contact Material: 黄铜; Contact Plating: 锡; Operating Temperature: -25℃~+85℃; Voltage Rating: 125V; Plastic Material: LCP
D6 = USBLC6-2SC6_C7519: 极性:单向;反向截止电压(Vrwm):5.25V;钳位电压:17V;峰值脉冲电流(Ipp):5A;击穿电压:6V;; LCSC Part Name: 单向ESD; Supplier Part: C7519; Manufacturer: ST(意法半导体); Supplier Footprint: SOT-23-6L; JLCPCB Part Class: 扩展库; Datasheet: https://item.szlcsc.com/datasheet/USBLC6-2SC6/7996.html; Supplier: LCSC; Polarity: 单向; Reverse Stand-Off Voltage (Vrwm): 5.25V; Clamping Voltage: 17V; Peak Pulse Current (Ipp): 5A; Voltage - Breakdown: 6V; Reverse Leakage Current (Ir): 150nA; Number of Channels: 双路; Operating Temperature: -40℃~+125℃; level of protection: IEC 61000-4-2; Type: ESD; Junction Capacitance: 3.5pF
H1 = LAIL-PZ2.54-4P-L: 插针结构:1x4P;间距:2.54mm;圆针/方针:方针;排数:单排;总PIN位数:4P;额定电流:3A;额定电压:250V;塑高:2.5mm;端接针长度:3mm;触头材质:黄铜;触头镀层:金;工作温度:-25℃~+80℃;颜色:黑色;; LCSC Part Name: 1x4P 间距:2.54mm 方针; Supplier Part: C54950602; Manufacturer: 莱联; Supplier Footprint: 插件,P=2.54mm; JLCPCB Part Class: Extended Part; Datasheet: https://item.szlcsc.com/datasheet/LAIL-PZ2.54-4P-L/58519955.html; Supplier: LCSC; Pin Structure: 1x4P; Pitch: 2.54mm; Circluar Pins/Square Pins: 方针; Number of Rows: 单排; Number of Pins: 4P; Current Rating: 3A; Voltage Rating (Max): 250V; Insulation Height: 2.5mm; Length of End Connection Pin: 3mm; Contact Material: 黄铜; Contact Plating: 金; Operating Temperature: -25℃~+80℃; Color: 黑色
L1 L4 = CBW201209U301T: 阻抗@频率:300Ω@100MHz;误差:±25%;直流电阻(DCR):200mΩ;; LCSC Part Name: 单路 0805磁珠 阻抗300Ω@100MHz; Supplier Part: C67451; Manufacturer: FH(风华); Supplier Footprint: 0805; JLCPCB Part Class: 扩展库; Datasheet: https://atta.szlcsc.com/upload/public/pdf/source/20171113/C141982_15105613387721115830.pdf; Supplier: LCSC; Impedance @ Frequency: 300Ω@100MHz; Tolerance: ±25%; DC Resistance(DCR): 200mΩ; Current Rating: 2A; Number of Circuits: 1
LED1 LED2 = XL-1608SURC-06: 灯头类型:-;发光颜色:红色;正向压降(Vf):2.3V;功率:50mW;正向电流:20mA;波长:620nm~630nm;二极管配置:-;透镜颜色:无色透明透镜;色温:-;发光强度:225mcd;发光角度:120°;载带方式:正贴;工作温度:-40℃~+85℃;; LCSC Part Name: 0603红色贴片式发光二极管; Supplier Part: C965799; Manufacturer: XINGLIGHT(成兴光); Supplier Footprint: 0603; JLCPCB Part Class: 扩展库; Datasheet: https://item.szlcsc.com/datasheet/XL-1608SURC-06/1051408.html; Supplier: LCSC; Illumination Color: 红色; Voltage - Forward(Vf): 2.3V; Power(Watts): 50mW; Forward Current: 20mA; Wavelength - Dominant: 620nm~630nm; Peak Wavelength: 625nm; Lens Color: 无色透明透镜; Luminous Intensity: 225mcd; Viewing Angle: 120°; Mounting Style: 正贴; Operating Temperature: -40℃~+85℃
R9 R10 R12-R15 R17 R19-R21 R24 R25 R27 R34-R37 = Res_0603: Supplier Footprint: 0603
R22 R23 = 0603WAF5101T5E: 电阻类型:厚膜电阻;阻值:5.1kΩ;精度:±1%;功率:100mW;工作电压:75V;温度系数:±100ppm/℃;; LCSC Part Name: 5.1kΩ ±1% 100mW 厚膜电阻; Supplier Part: C23186; Manufacturer: UNI-ROYAL(厚声); Supplier Footprint: 0603; JLCPCB Part Class: Basic Part; Datasheet: https://item.szlcsc.com/datasheet/0603WAF5101T5E/23913.html; Supplier: LCSC; Type: 厚膜电阻; Tolerance: ±1%; Power(Watts): 100mW; Voltage-Supply(Max): 75V; Temperature Coefficient: ±100ppm/℃; Operating Temperature: -55℃~+155℃
R28-R31 = FRC0603F33R0TS: 电阻类型:厚膜电阻;阻值:33Ω;精度:±1%;功率:100mW;工作电压:75V;温度系数:±100ppm/℃;; LCSC Part Name: 33Ω ±1% 100mW 厚膜电阻; Supplier Part: C2909394; Manufacturer: FOJAN(富捷); Supplier Footprint: 0603; JLCPCB Part Class: Extended Part; Supplier: LCSC; Type: 厚膜电阻; Tolerance: ±1%; Power(Watts): 100mW; Voltage-Supply(Max): 75V; Temperature Coefficient: ±100ppm/℃; Operating Temperature: -55℃~+155℃
R32 = 0603WAF1002T5E: 电阻类型:厚膜电阻;阻值:10kΩ;精度:±1%;功率:100mW;工作电压:75V;温度系数:±100ppm/℃;; LCSC Part Name: 厚膜电阻 10kΩ ±1% 100mW; Supplier Part: C25804; Manufacturer: UNI-ROYAL(厚声); Supplier Footprint: 0603; JLCPCB Part Class: Basic Part; Datasheet: https://item.szlcsc.com/datasheet/0603WAF1002T5E/26547.html; Supplier: LCSC; Type: 厚膜电阻; Tolerance: ±1%; Power(Watts): 100mW; Voltage-Supply(Max): 75V; Temperature Coefficient: ±100ppm/℃; Operating Temperature: -55℃~+155℃
R38 = FRC0603F0000TS: 电阻类型:厚膜电阻;阻值:0Ω;精度:±1%;功率:100mW;工作电压:75V;; LCSC Part Name: 0Ω ±1% 100mW 厚膜电阻; Supplier Part: C2906974; Manufacturer: FOJAN(富捷); Supplier Footprint: 0603; JLCPCB Part Class: Extended Part; Supplier: LCSC; Type: 厚膜电阻; Tolerance: ±1%; Power(Watts): 100mW; Voltage-Supply(Max): 75V; Operating Temperature: -55℃~+155℃
SW1 = TS-1088-AR02016: 电路结构:单刀单掷;按钮形状:圆形按钮;作用力:1.6N;安装方式:立贴;开关长度:3.9mm;开关宽度:3mm;开关高度:2mm;带支架:不带支架;触点电流:50mA;额定电压:12V;带灯:-;工作寿命:10万次;; LCSC Part Name: 3.9*3*2mm 立贴 轻触开关; Supplier Part: C720477; Manufacturer: XUNPU(讯普); Supplier Footprint: SMD,4x3mm; JLCPCB Part Class: Basic Part; Datasheet: https://item.szlcsc.com/datasheet/TS-1088-AR02016/763484.html; Supplier: LCSC; Circuit: 单刀单掷; Actuator Style: 圆形按钮; Operating Force: 1.6N; Mounting Type: 立贴; Length: 3.9mm; Width: 3mm; Switch Height: 2mm; with Bracket: 不带支架; Contact Current: 50mA; Voltage Rating: 12V; Actuator/Cap Color: 黑色; Termination Style: SMD接片; Life: 10万次; Operating Temperature: -30℃~+80℃
U12 = XC6206P332MR_C347376: 输出类型:固定;工作电压:8V;输出电压:3.3V;输出电流:250mA;电源纹波抑制比(PSRR):40dB@(1kHz);输出极性:正极;; LCSC Part Name: 高纹波抑制率、低功耗、低压差 CMOS 降压型电压稳压器; Supplier Part: C347376; Manufacturer: UMW(友台半导体); Supplier Footprint: SOT-23; JLCPCB Part Class: 扩展库; Datasheet: https://item.szlcsc.com/datasheet/XC6206P332MR/324036.html; Supplier: LCSC; Output Type: 固定; Voltage - Supply: 8V; Output Voltage: 3.3V; Output Current: 250mA; Power Supply Rejection Ratio (PSRR): 40dB@(1kHz); Voltage Dropout: 240mV@(50mA); standby current: 7uA; Features: 过流保护；短路保护; Operating Temperature: -25℃~+80℃@(Ta); Output Configuration: 正极; Number of Outputs: 1
U19 = STM32F407VET6: CPU内核:ARM-M4;CPU最大主频:168MHz;应用领域:-;; LCSC Part Name: 带DSP和FPU的高性能基础系列ARM Cortex-M4 MCU，具有512 KB Flash、168 MHz CPU、ART加速器、以太网和FSMC; Supplier Part: C28730; Manufacturer: ST(意法半导体); Supplier Footprint: LQFP-100(14x14); JLCPCB Part Class: 扩展库; Datasheet: https://item.szlcsc.com/datasheet/STM32F407VET6/29482.html; Supplier: LCSC; CPU Core: ARM-M4; CPU Maximum Speed: 168MHz; Program Storage Size: 512KB; Program Memory Type: FLASH; Number of I/O: 82; ADC (Bit): 12bit; DAC (Bit): 12bit; Voltage - Supply: 1.8V~3.6V
USB2 = TYPE-C 16PIN 2MD(073): 连接器类型:Type-C;协议标准:-;公母:母;安装方式:卧贴;触点数量:16P;端口数量:1;额定电流 - 电源:3A;工作温度:-25℃~+85℃;; LCSC Part Name: Type-C 母 卧贴; Supplier Part: C2765186; Manufacturer: SHOU HAN(首韩); Supplier Footprint: SMD; JLCPCB Part Class: 扩展库; Datasheet: https://item.szlcsc.com/datasheet/TYPE-C%252016PIN%25202MD(073)/2901843.html; Supplier: LCSC; Connector Type: Type-C; Gender: 母; Mounting Type: 卧贴; Number of Contacts: 16P; Number of Ports: 1; Current Rating-Power: 3A; Voltage Rating: 5V; Connect-Disconnect Life: 5千次; Detection color: 黑色; Operating Temperature: -25℃~+85℃
X3 = X32258MSB4SI: 晶振类型:贴片晶振;频率:8MHz;常温频差:±10ppm;负载电容:20pF;频率稳定度:±20ppm;; LCSC Part Name: YSX321SL 8MHZ 4P 3225 20PF ±10PPM -40~85℃ (±20PPM); Supplier Part: C2682774; Manufacturer: YXC(扬兴晶振); Supplier Footprint: SMD3225-4P; JLCPCB Part Class: 扩展库; Datasheet: https://item.szlcsc.com/datasheet/X32258MSB4SI/2777871.html; Supplier: LCSC; Type: 贴片晶振; Normal temperature Frequency Tolerance: ±10ppm; Load Capacitance: 20pF; Frequency Stability: ±20ppm; Equivalent Series Resistance(ESR): 120Ω; Operating Temperature: -40℃~+85℃
24V0_IN = Test-Point: Test Point 测试点; Check: false
C4 = JVJ50V330M10x10: 容值:330uF;精度:±20%;额定电压:50V;纹波电流:220mA@120Hz;; LCSC Part Name: 330uF ±20% 50V; Supplier Part: C46550419; Manufacturer: JIERR(捷而瑞); Supplier Footprint: SMD,D10xL10.5mm; JLCPCB Part Class: Extended Part; Datasheet: https://item.szlcsc.com/datasheet/JVJ50V330M10x10/48680113.html; Supplier: LCSC; Tolerance: ±20%; Voltage Rating: 50V; Ripple Current: 220mA@120Hz; Diameter: 10mm; Height - Seated (Max): 10.5mm; Lifetime: 2000hrs@105℃; Operating Temperature: -55℃~+105℃
C11 C24 = HGC0805R5475K500NSLJ: 容值:4.7uF;精度:±10%;额定电压:50V;温度系数:X5R;; LCSC Part Name: 4.7uF ±10% 50V; Supplier Part: C7472969; Manufacturer: Chinocera(华瓷); Supplier Footprint: 0805; JLCPCB Part Class: Extended Part; Datasheet: https://item.szlcsc.com/datasheet/HGC0805R5475K500NSLJ/8532816.html; Supplier: LCSC; Tolerance: ±10%; Voltage Rating: 50V; Temperature Coefficient: X5R
C16 C17 = CL31A226KAHNNNE: 容值:22uF;精度:±10%;额定电压:25V;温度系数:X5R;; LCSC Part Name: 22uF ±10% 25V; Supplier Part: C12891; Manufacturer: SAMSUNG(三星); Supplier Footprint: 1206; JLCPCB Part Class: 基础库; Datasheet: https://item.szlcsc.com/datasheet/CL31A226KAHNNNE/13537.html; Supplier: LCSC; Tolerance: ±10%; Voltage Rating: 25V; Temperature Coefficient: X5R
C18 C19 C39 = 1206X5R106K500NT: 容值:10uF;精度:±10%;额定电压:50V;温度系数:X5R;; LCSC Part Name: 10uF ±10% 50V; Supplier Part: C49326740; Manufacturer: AIDE(爱迪电容); Supplier Footprint: 1206; JLCPCB Part Class: Extended Part; Datasheet: https://item.szlcsc.com/datasheet/1206X5R106K500NT/51802570.html; Supplier: LCSC; Tolerance: ±10%; Voltage Rating: 50V; Temperature Coefficient: X5R
C26 = JVJ50V100M6x8: 容值:100uF;精度:±20%;额定电压:50V;纹波电流:140mA@120Hz;; LCSC Part Name: 100uF ±20% 50V; Supplier Part: C46550415; Manufacturer: JIERR(捷而瑞); Supplier Footprint: SMD,D6.3xL7.7mm; JLCPCB Part Class: Extended Part; Datasheet: https://item.szlcsc.com/datasheet/JVJ50V100M6x8/48680109.html; Supplier: LCSC; Tolerance: ±20%; Voltage Rating: 50V; Ripple Current: 140mA@120Hz; Diameter: 6.3mm; Height - Seated (Max): 7.7mm; Lifetime: 2000hrs@105℃; Operating Temperature: -55℃~+105℃
C27 = MA50V22M6X6: 容值:22uF;精度:±20%;额定电压:50V;纹波电流:2.65A@100kHz;等效串联电阻(ESR):40mΩ@100kHz;类型:聚合物;; LCSC Part Name: 22uF ±20% 50V; Supplier Part: C46550474; Manufacturer: JIERR(捷而瑞); Supplier Footprint: SMD,D6.3xL6mm; JLCPCB Part Class: Extended Part; Datasheet: https://item.szlcsc.com/datasheet/MA50V22M6X6/48680168.html; Supplier: LCSC; Tolerance: ±20%; Voltage Rating: 50V; Ripple Current: 2.65A@100kHz; Equivalent Series Resistance(ESR): 40mΩ@100kHz; Type: 聚合物; Diameter: 6.3mm; Height - Seated (Max): 6mm; Lifetime: 2000hrs@105℃; Operating Temperature: -55℃~+105℃; Polarity type: 有极性
C28 = KY1102M400VAC70Y10093: 容值:1nF;精度:±20%;工作电压(AC):400V;防护等级:Y1;; LCSC Part Name: 1nF ±20% 400V 等级:Y1; Supplier Part: C2943996; Manufacturer: KNSCHA(科尼盛); Supplier Footprint: 插件,P=10mm; JLCPCB Part Class: Extended Part; Datasheet: https://item.szlcsc.com/datasheet/KY1102M400VAC70Y10093/3329207.html; Supplier: LCSC; Tolerance: ±20%; Voltage(AC): 400V; Ratings: Y1; safety certification: UL；ENEC；VDE；CQC
C41 C42 = CAP_0603: Supplier Footprint: 0603; Sim Model: eb8db00cf755486a99d82f511adf71ce; Sim Model Title: Capacitor; Sim Model Path: 0819f05c4eef4c71ace90d822a990e87; NGSpice Model: b0400270a9e64a8faba05adf23a90584; NGSpice Model Title: Capacitor; NGspice Model Path: 0819f05c4eef4c71ace90d822a990e87
C177 = FCC0603B224K500CT: 容值:220nF;精度:±10%;额定电压:50V;温度系数:X7R;; LCSC Part Name: ±0.25pF 220nF ±10% 50V; Supplier Part: C5137500; Manufacturer: FOJAN(富捷); Supplier Footprint: 0603; JLCPCB Part Class: Extended Part; Datasheet: https://item.szlcsc.com/datasheet/FCC0603B224K500CT/5747002.html; Supplier: LCSC; Tolerance: ±10%; Voltage Rating: 50V; Temperature Coefficient: X7R
CN1 CN2 CN4 = LAIL-PHC3.96-2P-01-VH-L: 插针结构:1x2P;间距:3.96mm;安装方式:直插;参考系列:VH;总PIN数:2P;排数:1;每排PIN数:2;额定电流:7A;触头材质:黄铜;触头镀层:锡;工作温度:-25℃~+85℃;; LCSC Part Name: 1x2P 间距:3.96mm 直插 系列:VH; Supplier Part: C54905992; Manufacturer: LAILAN(莱联); Supplier Footprint: 插件,P=3.96mm; JLCPCB Part Class: Extended Part; Datasheet: https://item.szlcsc.com/datasheet/LAIL-PHC3.96-2P-01-VH-L/58431119.html; Supplier: LCSC; Pins Structure: 1x2P; Pitch: 3.96mm; Mounting Type: 直插; Reference Series: VH; Number of Pins: 2P; Number of Rows: 1; Number of PINs Per Row: 2; Current Rating: 7A; Contact Material: 黄铜; Contact Plating: 锡; Operating Temperature: -25℃~+85℃; Voltage Rating: 250V; Plastic Material: PA66; Flame Retardant Rating: UL94V-0; Color: 白色; Z-Height of the Board: 9.4mm; X-Length of Bottom Edge on Board (Spacing Line): 7.92mm; Y-Width of Bottom Edge on Board: 8.1mm
CN5 = VH3.96-2P ZZ: 插针结构:1x2P;间距:3.96mm;安装方式:直插;参考系列:VH;总PIN数:2P;排数:1;每排PIN数:2;行距:-;额定电流:7A;触头材质:黄铜;触头镀层:锡;工作温度:-25℃~+85℃;; LCSC Part Name: 1x2P 间距:3.96mm 直插 系列:VH; Supplier Part: C5379868; Manufacturer: SHOU HAN(首韩); Supplier Footprint: 插件,P=3.96mm; JLCPCB Part Class: 扩展库; Datasheet: https://item.szlcsc.com/datasheet/VH3.96-2P%2520ZZ/6244976.html; Supplier: LCSC; Pins Structure: 1x2P; Pitch: 3.96mm; Mounting Type: 直插; Reference Series: VH; Number of Pins: 2P; Number of Rows: 1; Number of PINs Per Row: 2; Current Rating: 7A; Contact Material: 黄铜; Contact Plating: 锡; Operating Temperature: -25℃~+85℃; Voltage Rating: 250V; Plastic Material: PA66; Flame Retardant Rating: UL94V-0; Color: 白色
D1 D2 = SB1045L_C908747: 二极管配置:独立式;正向压降(Vf):530mV@10A;直流反向耐压(Vr):45V;整流电流:10A;; LCSC Part Name: 电压:45V 电流:10A; Supplier Part: C908747; Manufacturer: GOODWORK(固得沃克); Supplier Footprint: TO-277; JLCPCB Part Class: 扩展库; Datasheet: https://item.szlcsc.com/datasheet/SB1045L/975499.html; Supplier: LCSC; Diode Configuration: 独立式; Voltage - Forward(Vf@If): 530mV@10A; Voltage - DC Reverse(Vr): 45V; Current - Rectified: 10A; Reverse Leakage Current (Ir): 150uA; Non-Repetitive Peak Forward Surge Current: 150A
D7 = PESD24VL1BA_C28310454: 极性:双向;反向截止电压(Vrwm):24V;钳位电压:70V;峰值脉冲电流(Ipp):3A;峰值脉冲功率(Ppp):200W;击穿电压(VBR):25.4V;; LCSC Part Name: 双向ESD 24V截止 峰值脉冲电流：3A; Supplier Part: C28310454; Manufacturer: GOODWORK(固得沃克); Supplier Footprint: SOD-323; JLCPCB Part Class: Extended Part; Datasheet: https://item.szlcsc.com/datasheet/PESD24VL1BA/30046924.html; Supplier: LCSC; Polarity: 双向; Reverse Stand-Off Voltage (Vrwm): 24V; Clamping Voltage: 70V; Peak Pulse Current (Ipp): 3A; Peak Pulse Power Dissipation (Ppp): 200W; Voltage - Breakdown: 25.4V; Reverse Leakage Current (Ir): 500nA; Number of Channels: 单路; Operating Temperature: -55℃~+150℃; level of protection: IEC 61000-4-4；IEC 61000-4-5；IEC 61000-4-2; Type: ESD; Junction Capacitance: 11pF
D8 = 5.0SMDJ30A_C42394446: 极性:单向;反向工作电压(Vrwm):30V;钳位电压:48.4V;峰值脉冲电流(Ipp):103A;峰值脉冲功率(Ppp):5kW@10/1000us;击穿电压(VBR):36.8V;; LCSC Part Name: 单向TVS 30V截止 峰值浪涌电流：103A; Supplier Part: C42394446; Manufacturer: R+O(宏嘉诚); Supplier Footprint: DO-214AB(SMC); JLCPCB Part Class: Extended Part; Datasheet: https://item.szlcsc.com/datasheet/5.0SMDJ30A/44336004.html; Supplier: LCSC; Polarity: 单向; Reverse Stand-Off Voltage (Vrwm): 30V; Clamping Voltage: 48.4V; Peak Pulse Current (Ipp): 103A; Peak Pulse Power Dissipation (Ppp): 5kW@10/1000us; Voltage - Breakdown: 36.8V; Reverse Leakage Current (Ir): 5uA; Number of Channels: 单路; Operating Temperature: -55℃~+150℃; level of protection: IEC 61000-4-2; Type: TVS
D9 D11 D12 = 1SMA4749A_C19077485: 二极管配置:独立式;稳压值(标称值):24V;稳压值(范围):22.8V~26V;耗散功率(Pd):1W;; LCSC Part Name: 独立式 耐压:24V 电流:5uA@18V; Supplier Part: C19077485; Manufacturer: R+O(宏嘉诚); Supplier Footprint: DO-214AC(SMA); JLCPCB Part Class: Extended Part; Datasheet: https://item.szlcsc.com/datasheet/1SMA4749A/20275570.html; Supplier: LCSC; Diode Configuration: 独立式; Zener Voltage(Nom): 24V; Reverse Leakage Current (Ir): 5uA@18V; Zener Voltage(Range): 22.8V~26V; Pd - Power Dissipation: 1W; Impedance(Zzt): 25Ω; Operating Junction Temperature Range: -55℃~+150℃
D10 = DSK24_C22466352: 二极管配置:独立式;正向压降(Vf):550mV@2A;直流反向耐压(Vr):40V;整流电流:2A;; LCSC Part Name: 电压:40V 电流:2A; Supplier Part: C22466352; Manufacturer: R+O(宏嘉诚); Supplier Footprint: SOD-123FL; JLCPCB Part Class: Extended Part; Datasheet: https://item.szlcsc.com/datasheet/DSK24/24165511.html; Supplier: LCSC; Diode Configuration: 独立式; Voltage - Forward(Vf@If): 550mV@2A; Voltage - DC Reverse(Vr): 40V; Current - Rectified: 2A; Reverse Leakage Current (Ir): 500uA@40V; Operating Junction Temperature Range: -55℃~+125℃; Non-Repetitive Peak Forward Surge Current: 50A
F5 = SMD1812-150-24: 耐压(Vmax):24V;最大电流(Imax):40A;保持电流(Ihold):1.5A;跳闸电流(Itrip):3A;; LCSC Part Name: 24V 1.5A; Supplier Part: C46641161; Manufacturer: R+O(宏嘉诚); Supplier Footprint: 1812; JLCPCB Part Class: Extended Part; Datasheet: https://item.szlcsc.com/datasheet/SMD1812-150-24/48798767.html; Supplier: LCSC; Voltage - Max: 24V; Current - Max: 40A; Hold Current: 1.5A; Trip Current: 3A; Power Dissipation: 1W; Resistance - Initial (Ri) (Min): 40mΩ; Resistance - Post Trip (R1) (Max): 160mΩ; Time to Trip(Max): 500ms; Operating Temperature: -40℃~+85℃; Length: 4.73mm; Width: 3.41mm; Height: 1.1mm
L2 = MWSA0603S-100MT: 电感值:10uH;精度:±20%;额定电流:4.5A;饱和电流(Isat):5.5A;类型:-;; LCSC Part Name: 10uH ±20% 5.5A; Supplier Part: C132141; Manufacturer: Sunlord(顺络); Supplier Footprint: SMD,7x6.6mm; JLCPCB Part Class: Extended Part; Datasheet: https://item.szlcsc.com/datasheet/MWSA0603S-100MT/143440.html; Supplier: LCSC; Tolerance: ±20%; Current Rating: 4.5A; Current - Saturation(Isat): 5.5A; DC Resistance(DCR): 67mΩ
L5 = PDMTAT044125-100MLU: 电感值:10uH;精度:±20%;额定电流:9A;类型:环型电感;; LCSC Part Name: 10uH ±20% 环型电感; Supplier Part: C3011531; Manufacturer: PROD(谱罗德); Supplier Footprint: 插件,16x8.5mm; JLCPCB Part Class: Extended Part; Datasheet: https://item.szlcsc.com/datasheet/PDMTAT044125-100MLU/3515110.html; Supplier: LCSC; Tolerance: ±20%; Current Rating: 9A; DC Resistance(DCR): 10mΩ; Type: 环型电感; Wire Diameter: 0.8mm
Q6 = MSK50P03NF: 数量:-;漏源电压(Vdss):30V;连续漏极电流(Id):50A;导通电阻(RDS(on)):9mΩ@10V；18mΩ@4.5V;耗散功率(Pd):3W;阈值电压(Vgs(th)):1.5V;; LCSC Part Name: P沟道 MOSFET,电流:-50A,耐压:-30V; Supplier Part: C2902919; Manufacturer: MSKSEMI(美森科); Supplier Footprint: DFN-8(5x6); JLCPCB Part Class: Extended Part; Datasheet: https://item.szlcsc.com/datasheet/MSK50P03NF/3157373.html; Supplier: LCSC; Drain to Source Voltage: 30V; Current - Continuous Drain(Id): 50A; RDS(on): 9mΩ@10V；18mΩ@4.5V; Pd - Power Dissipation: 3W; Gate Threshold Voltage (Vgs(th)): 1.5V; Gate Charge(Qg): 24nC@10V; Input Capacitance(Ciss): 1.75nF; Reverse Transfer Capacitance (Crss@Vds): 180pF; Operating Temperature: -55℃~+150℃; Type: P沟道; Output Capacitance(Coss): 215pF
R11 = MOV14D560K206RV085: 压敏电压:50V~62V;钳位电压:110V;工作电压:45V;工作电压(AC):35V;; LCSC Part Name: 14D560K; Supplier Part: C22390371; Manufacturer: KNSCHA(科尼盛); Supplier Footprint: 插件,P=7.5mm; JLCPCB Part Class: Extended Part; Datasheet: https://atta.szlcsc.com/upload/public/pdf/source/20240515/0F248DF2A1F6093B94165AA6EFFEB7ED.pdf; Supplier: LCSC; Varistor Voltage: 50V~62V; Clamping Voltage: 110V; Maximum DC Volts: 45V; Maximum AC Volts: 35V; Energy: 19.6J
R82 = RC0603FR-07649KL: 电阻类型:厚膜电阻;阻值:649kΩ;精度:±1%;功率:100mW;工作电压:75V;温度系数:±100ppm/℃;; LCSC Part Name: 厚膜电阻 649kΩ ±1% 100mW; Supplier Part: C245991; Manufacturer: YAGEO(国巨); Supplier Footprint: 0603; JLCPCB Part Class: Extended Part; Datasheet: https://item.szlcsc.com/datasheet/RC0603FR-07649KL/243492.html; Supplier: LCSC; Type: 厚膜电阻; Tolerance: ±1%; Power(Watts): 100mW; Voltage-Supply(Max): 75V; Temperature Coefficient: ±100ppm/℃; Operating Temperature: -55℃~+155℃
R83 = FRC0603F3R30TS: 电阻类型:厚膜电阻;阻值:3.3Ω;精度:±1%;功率:100mW;工作电压:75V;温度系数:±200ppm/℃;; LCSC Part Name: 3.3Ω ±1% 100mW 厚膜电阻; Supplier Part: C2930016; Manufacturer: FOJAN(富捷); Supplier Footprint: 0603; JLCPCB Part Class: Extended Part; Supplier: LCSC; Type: 厚膜电阻; Tolerance: ±1%; Power(Watts): 100mW; Voltage-Supply(Max): 75V; Temperature Coefficient: ±200ppm/℃; Operating Temperature: -55℃~+155℃
U2 = XT60-M.: 类别:-;类型1:-;; LCSC Part Name: AMASS(艾迈斯) XT60模型插头 3.5mm镀金香蕉头公头（电调端）XT60-M; Supplier Part: C98733; Manufacturer: AMASS(艾迈斯); JLCPCB Part Class: 扩展库; Datasheet: https://item.szlcsc.com/datasheet/XT60-M./99943.html; Supplier: LCSC; Type: 香蕉头; Colour: 黄色; InterfaceType: 公头; specifications: 3.5mm
U3 = URB2405S-6WR3_C179791: 特性：宽4:1输入电压范围。 高效率达87%。 空载功耗低至0.12W。 输入输出隔离测试电压1.6kV DC。 输入欠压保护、输出短路和过流保护。 工作环境温度范围：-40℃至+105℃。应用：医疗。 工业控制; LCSC Part Name: 9V~36V 5V 1.2A 6W; Supplier Part: C179791; Manufacturer: MORNSUN(金升阳); Manufacturer Part: URB2405S-6WR3; Supplier Footprint: SIP,22x9.5mm; JLCPCB Part Class: Extended Part; Datasheet: https://item.szlcsc.com/datasheet/URB2405S-6WR3/191186.html; Supplier: LCSC; Number of Outputs: 1; Output Power: 6W; Voltage - Supply: 9V~36V; Conversion Efficiency: 82%; Output Voltage: 5V; Output Current(Max): 1.2A; Capacitive Load(Max): 1000uF; Isolation Voltage(Vrms): 1.6kV; Features: 欠压保护；短路保护；过流保护；轻载高效模式; Operating Temperature: -40℃~+105℃; Ripple Noise: 50mVp-p; Length: 22mm; Width: 9.5mm; Height: 12mm
U13 = MM1Z5V1B_C22466343: 二极管配置:独立式;稳压值(标称值):5.1V;稳压值(范围):5V~5.2V;耗散功率(Pd):500mW;; LCSC Part Name: 表面贴装齐纳二极管; Supplier Part: C22466343; Manufacturer: R+O(宏嘉诚); Supplier Footprint: SOD-123; JLCPCB Part Class: Extended Part; Datasheet: https://item.szlcsc.com/datasheet/MM1Z5V1B/24165502.html; Supplier: LCSC; Diode Configuration: 独立式; Zener Voltage(Nom): 5.1V; Reverse Leakage Current (Ir): 2uA@1.5V; Zener Voltage(Range): 5V~5.2V; Pd - Power Dissipation: 500mW; Impedance(Zzt): 130Ω; Operating Junction Temperature Range: -55℃~+150℃
U21 = RT7272BGSP: 功能类型:降压型;输出类型:可调;工作电压:4.5V~36V;输出电压:800mV~30V;输出电流:3A;; LCSC Part Name: 3A, 36V, 500kHz 同步降压转换器; Supplier Part: C127866; Manufacturer: RICHTEK(立锜); Supplier Footprint: SOIC-8-EP; JLCPCB Part Class: Extended Part; Datasheet: https://atta.szlcsc.com/upload/public/pdf/source/20180403/C127866_C96022CD8724BC3A1F23EF273B4658E0.pdf; Supplier: LCSC; Function: 降压型; Output Type: 可调; Input Voltage: 4.5V~36V; Output Voltage: 800mV~30V; Output Current: 3A; Switching Frequency: 500kHz; Operating Temperature: -40℃~+125℃; Synchronous Rectification: 是; Number of Outputs: 1; Topology: 降压式; Quiescent Current (Iq): 900uA; Switch tube (built-in/external): 内置

## Nets
3V3: 3.3V.1 C2.2 C32.1 C33.1 C35.2 C168.2 H1.4 L1.1 LED1.2(A) R2.2 R4.1 R6.2 R8.2 R9.1 R10.1 R24.1 R25.2 R32.2 R34.2 R35.2 R36.1 R37.1 R70.1 R72.2 U1.8(VCC) U12.2(VOUT) U24.8(VCC)
3V3_MCU: C31.2 C140.2 L1.2 L4.1 U19.11(VDD) U19.19(VDD) U19.28(VDD) U19.50(VDD) U19.75(VDD) U19.100(VDD)
24V0: 24V0.1 C12.2 C13.2 C14.2 C18.2 C19.2 C20.2 C38.2 C39.2 C40.2 CN1.1 CN2.1 CN4.1 D9.1(K) D11.1(K) D12.1(K) Q6.5(D) Q6.6(D) Q6.7(D) Q6.8(D) R13.2 U21.8(VIN)
24V0_IN: 24V0_IN.1 C4.1 C11.1 C29.2 D1.2(K) D2.2(K) L5.1 Q6.1(S) Q6.2(S) Q6.3(S) R11.1 R14.2 R15.1
+5V: C3.2 C5.2 C6.2 C7.2 C8.2 C9.2 C10.2 C16.2 C17.2 C22.2 C25.2 C26.1 C34.2 C36.2 C37.2 C41.2 C42.1 CN5.2 CN6.1 CN7.1 D6.5 L2.2 R19.2 U3.6(+VO) U4.3 U5.3 U7.3 U8.3 U9.3 U10.3 U11.3 U12.3(VIN) U13.1(C) USB2.2(VBUS) USB2.11(VBUS)
AGND: C4.2 C11.2 C24.2 C28.1 R11.2 U3.1(GND)
GND: C1.1 C2.1 C3.1 C5.1 C6.1 C7.1 C8.1 C9.1 C10.1 C12.1 C13.1 C14.1 C16.1 C17.1 C22.1 C23.1 C25.1 C26.2 C27.2 C28.2 C31.1 C32.2 C33.2 C34.1 C35.1 C36.1 C37.1 C41.1 C42.2 C109.1 C110.1 C140.1 C166.2 C167.2 C168.1 C169.1 C170.1 C171.1 CN5.1 CN6.2 CN6.5 CN6.6 CN7.2 CN7.5 CN7.6 CN8.5 CN8.6 CN9.5 CN9.6 D3.2 D4.2 D6.2 D19.2 D20.2 H1.1 Q1.2(E) Q4.2(E) R3.1 R5.2 R16.1 R17.2 R18.1 R20.1 R21.1 R22.1 R23.1 R27.2 R33.1 R38.1 R40.1 R69.1 R71.2 SW1.2 U1.4(DI) U1.5(GND) U3.7(0V) U4.4 U5.4 U7.4 U8.4 U9.4 U10.4 U11.4 U12.1(VSS) U13.2(A) U19.10(VSS) U19.27(VSS) U19.74(VSS) U19.99(VSS) U21.4(GND) U21.9(EPAD) U24.4(DI) U24.5(GND) USB2.1(GND) USB2.12(GND) X3.2(GND) X3.4(GND)
VDDA: C141.2 C142.2 L4.2 U19.21(VREF+) U19.22(VDDA)
BAT_A: CN3.2 CN12.2 F1.2 U4.1
BAT_B: CN3.1 CN12.1 F2.2 U4.2
BAT_GND: C18.1 C19.1 C20.1 C38.1 C39.1 C40.1 C177.1 CN1.2 CN2.2 CN4.2 D7.1 D8.2(A) D9.2(A) D11.2(A) D12.2(A) R82.1 U2.1(-)
KEY: C29.1 D7.2 D10.2(A) R12.1 R14.1
NRST: C23.2 R24.2 SW1.1 U19.14(NRST)
PA0_TIM5_CH1: U19.23(PA0-WKUP(PA0))
PA1_TIM5_CH2: U19.24(PA1)
PA2_TIM2_CH3: U19.25(PA2)
PA4_SPI1_NSS: CN8.1 U19.29(PA4)
PA5_SPI1_SCK: CN8.2 U19.30(PA5)
PA6_SPI1_MISO: CN8.3 U19.31(PA6)
PA7_SPI1_MOSI: CN8.4 U19.32(PA7)
PA8: U19.67(PA8)
PA9: U19.68(PA9)
PA15: U19.77(PA15(JTDI))
PB6_I2C1_SCL: CN9.1 R34.1 U19.92(PB6)
PB7_I2C1_SDA: CN9.2 R35.1 U19.93(PB7)
PB10_UART3_TX: CN6.3 R36.2 U19.47(PB10)
PB11_UART3_RX: CN6.4 R37.2 U19.48(PB11)
PC0_ADC123_IN10: U19.15(PC0)
PC1_ADC123_IN11: U19.16(PC1)
PC2_ADC123_IN12: U19.17(PC2)
PC3_ADC123_IN13: U19.18(PC3)
PC4: LED2.2(A) U19.33(PC4)
PC5: U19.34(PC5)
PC6: U19.63(PC6)
PC7: U19.64(PC7)
PC8: U19.65(PC8)
PC9: U19.66(PC9)
PC10_UART4_TX: R1.1 U19.78(PC10)
PC11_UART4_RX: R8.1 U1.1(RO) U19.79(PC11)
PC12: U19.80(PC12)
PD5_UART2_TX_BAT: R68.1 U19.86(PD5)
PD6_UART2_RX_BAT: R2.1 U19.87(PD6) U24.1(RO)
PD8_UART3_TX: CN7.3 R9.2 U19.55(PD8)
PD9_UART3_RX: CN7.4 R10.2 U19.56(PD9)
SENSOR_A: F3.2 U5.1 U7.1 U8.1 U9.1 U10.1 U11.1
SENSOR_B: F4.2 U5.2 U7.2 U8.2 U9.2 U10.2 U11.2
SWCLK: H1.2 R27.1 U19.76(PA14(JTCK-SWCLK))
SWDIO: H1.3 R25.1 U19.72(PA13(JTMS-SWDIO))
USB_D+: R28.2 USB2.6(DP1) USB2.8(DP2)
USB_D-: R29.1 USB2.5(DN2) USB2.7(DN1)
USB_DM: R30.1 U19.70(PA11)
USB_DP: R31.1 U19.71(PA12)
$3N900: C109.2 U19.12(PH0-OSC_IN(PH0)) X3.3
$3N913: C110.2 U19.13(PH1-OSC_OUT(PH1)) X3.1
$3N1102: R18.2 U19.94(BOOT0)
$3N27755: C141.1 C142.1 R38.2 U19.20(VSSA)
$3N37466: R40.2 U19.37(PB2-BOOT1(PB2))
$3N43765: C166.1 U19.73(VCAP_2)
$3N43824: C167.1 U19.49(VCAP_1)
$5N582: Q1.3(C) R70.2 U24.2(#RE) U24.3(DE)
$5N1333: D19.1 D21.2 F2.1 R71.1 R73.2 U24.7(B)
$5N1784: D20.1 D21.1 F1.1 R72.1 R73.1 U24.6(A)
$5N3154: C169.2 U25.1
$5N3161: C170.2 U26.1
$5N3166: C171.2 U27.1
$5N6846: Q1.1(B) R68.2 R69.2
$5N6850: C1.2 U28.1
$5N6855: D4.1 D5.1 F3.1 R6.1 R7.1 U1.6(A)
$5N6860: D3.1 D5.2 F4.1 R5.1 R7.2 U1.7(B)
$5N6865: Q4.1(B) R1.2 R3.2
$5N6867: Q4.3(C) R4.2 U1.2(#RE) U1.3(DE)
$9N4816: LED2.1(K) R16.2
$9N50408: C177.2 R83.1
$9N50445: R13.1 U21.3(EN)
$9N50446: R17.1 U21.7(RLIM)
$9N50450: C15.2 U21.2(BOOT)
$9N50451: C15.1 L2.1 U21.1(SW)
$9N50452: R19.1 R20.2 U21.5(FB)
$9N50454: C21.2 U21.6(COMP)
$9N50457: C21.1 R21.2
Net-(C24-1): C24.1 L5.2 U3.2(VIN)
Net-(C27-1): C27.1 U3.8(NC)
Net-(D1-1): D1.1(A) D1.3(A) D2.1(A) D2.3(A) D8.1(K) F5.2 R82.2 R83.2
Net-(D6-1): D6.1 R31.2 R32.1
Net-(D6-3): D6.3 R30.2
Net-(D6-4): D6.4 R29.2
Net-(D6-6): D6.6 R28.1
Net-(D10-1): D10.1(C) Q6.4(G) R12.2 R15.2
Net-(F5-1): F5.1 U2.2(+)
Net-(LED1-1): LED1.1(K) R33.2
Net-(R22-2): R22.2 USB2.10(CC2)
Net-(R23-2): R23.2 USB2.4(CC1)

Not connected (* = marked no-connect by the designer): CN9 3 4; U3 3(CTRL)* 5(NC)*; U19 1(PE2)* 2(PE3)* 3(PE4)* 4(PE5)* 5(PE6)* 6(VBAT) 7(PC13)* 8(PC14-OSC32_IN(PC14))* 9(PC15-OSC32_OUT(PC15))* 26(PA3) 35(PB0)* 36(PB1)* 38(PE7)* 39(PE8)* 40(PE9)* 41(PE10)* 42(PE11)* 43(PE12)* 44(PE13)* 45(PE14)* 46(PE15)* 51(PB12)* 52(PB13)* 53(PB14)* 54(PB15)* 57(PD10)* 58(PD11)* 59(PD12)* 60(PD13)* 61(PD14)* 62(PD15)* 69(PA10) 81(PD0)* 82(PD1)* 83(PD2)* 84(PD3)* 85(PD4)* 88(PD7)* 89(PB3(JTDOTRACESWO))* 90(PB4(NJTRST))* 91(PB5)* 95(PB8)* 96(PB9)* 97(PE0)* 98(PE1)*; USB2 3(SBU2) 9(SBU1) 13(SHELL) 14(SHELL)

## Notes on the sheets
sheet 1
- 电源
- 上下拉电阻可要可不要，只是为了让引脚的状态更稳定
- 复位按键
- USB
- 烧录口
sheet 2
- NC
- 超声波传感器485
- 电池485通信
- 温度传感器
sheet 3
- 24V
- 5V
- 3W
- 600mA
- 满电约25.2V左右
  放电后约18V左右
- 二极管有0.3v的压降
- 由于电机的功率较大，所以为了保险起见采用继电器和单点接地的方式隔离主控板和电机
- 开关
- 此处选取pmos作为开关管，采取高边控制
- 24V
- 5V
- 3A
- 继电器（YP180）
- 上位机供电
- NC
- 24V供电
- 非隔离降压方案
- 5V供电
sheet 4
- BAT
- RELAY
- MOTO_POW
- 5v
- MCU
- GYO
- sensor 485
- usb
- Depth sensor
- Relay
